# EAGLE design MeadowF7TestBoard_RevA (EAGLE 9.3.2)
PART_NUMBER: Meadow F7 Micro; REV: A
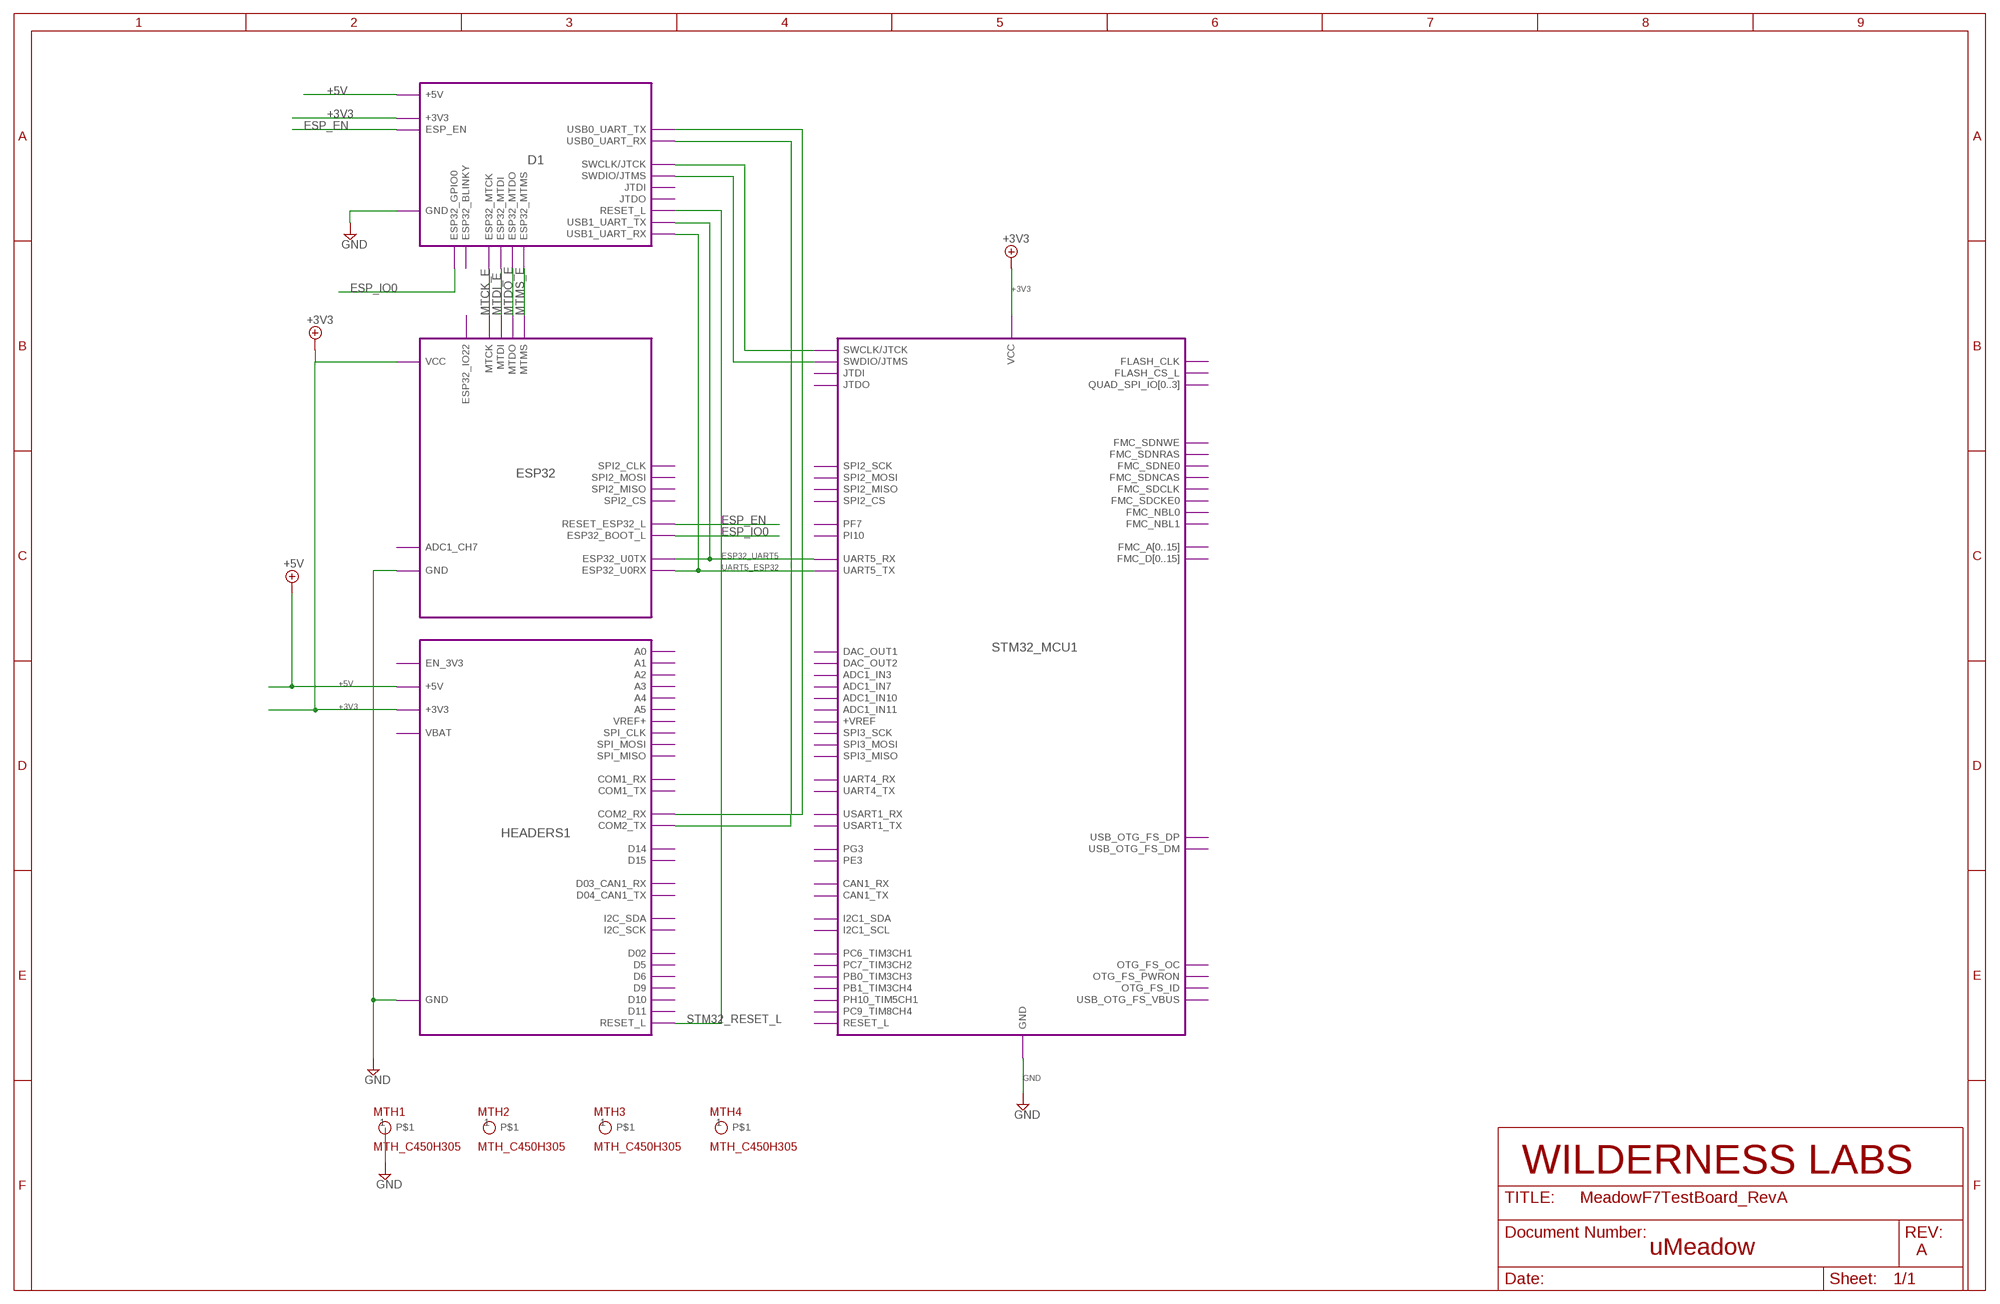
[diagram p0: schematic, sheet 1]

## Parts
MTH1  MTH_C450H305  [C450H305]
MTH2  MTH_C450H305  [C450H305]
MTH3  MTH_C450H305  [C450H305]
MTH4  MTH_C450H305  [C450H305]

## Module instances
STM32_MCU1 = STM32_MCU (part numbers offset by 400)
ESP32 = WIFI_BLUETOOTH (part numbers offset by 200)
HEADERS1 = HEADERS (part numbers offset by 300)
D1 = DEBUG (part numbers offset by 100)

## Nets
+3V3 [POWER]: port STM32_MCU1.VCC HEADERS1.+3V3 ESP32.VCC D1.+3V3
+5V [5V]: port HEADERS1.+5V D1.+5V ; supply symbol labelled +3V3
ESP32_UART5: port STM32_MCU1.UART5_RX ESP32.ESP32_U0TX D1.USB1_UART_TX
ESP_EN: port D1.ESP_EN ESP32.RESET_ESP32_L
ESP_IO0: port D1.ESP32_GPIO0 ESP32.ESP32_BOOT_L
GND [POWER]: MTH1.1 ; port ESP32.GND HEADERS1.GND STM32_MCU1.GND D1.GND
MTCK_E: port D1.ESP32_MTCK ESP32.MTCK
MTDI_E: port D1.ESP32_MTDI ESP32.MTDI
MTDO_E: port D1.ESP32_MTDO ESP32.MTDO
MTMS_E: port D1.ESP32_MTMS ESP32.MTMS
N$1: port D1.SWDIO/JTMS STM32_MCU1.SWDIO/JTMS
N$2: port D1.SWCLK/JTCK STM32_MCU1.SWCLK/JTCK
N$3: port D1.USB0_UART_RX HEADERS1.COM2_TX
N$4: port D1.USB0_UART_TX HEADERS1.COM2_RX
STM32_RESET_L: port HEADERS1.RESET_L D1.RESET_L
UART5_ESP32: port ESP32.ESP32_U0RX STM32_MCU1.UART5_TX D1.USB1_UART_RX
Unconnected: MTH2.1 MTH3.1 MTH4.1

## Library data of the parts
MTH1-MTH4 = SLJ_MECH:MTH_: Mounting Hole. C<X>H<Y> X is Pad diameter Y is drill diameter; DRILL: 3.05MM; PAD: 4.5MM

## Module STM32_MCU
Ports: SPI2_SCK(out) SPI2_MOSI(out) SPI2_MISO(in) SPI2_CS(out) PF7(out) PI10(out) UART5_RX(in) UART5_TX(out) FMC_A[0..15](out) FMC_D[0..15](io) FMC_NBL1(out) FMC_NBL0(out) FMC_SDCKE0(out) FMC_SDCLK(out) FMC_SDNCAS(out) FMC_SDNE0(out) FMC_SDNRAS(out) FMC_SDNWE(out) FLASH_CLK(out) FLASH_CS_L(out) QUAD_SPI_IO[0..3](io) DAC_OUT1(io) DAC_OUT2(io) ADC1_IN7(io) ADC1_IN10(io) ADC1_IN11(io) ADC1_IN3(io) +VREF(pas) SPI3_SCK(io) SPI3_MOSI(io) SPI3_MISO(io) UART4_RX(in) UART4_TX(out) USART1_TX(out) USART1_RX(in) PG3(io) PE3(io) CAN1_RX(io) CAN1_TX(io) I2C1_SDA(io) I2C1_SCL(io) PC6_TIM3CH1(io) PC7_TIM3CH2(io) PB0_TIM3CH3(io) PB1_TIM3CH4(io) PH10_TIM5CH1(io) PC9_TIM8CH4(io) RESET_L(io) OTG_FS_OC(in) OTG_FS_ID(in) USB_OTG_FS_VBUS(in) OTG_FS_PWRON(out) USB_OTG_FS_DP(io) USB_OTG_FS_DM(io) VCC(pwr) GND(pwr) SWCLK/JTCK(io) SWDIO/JTMS(io) JTDI(io) JTDO(io)
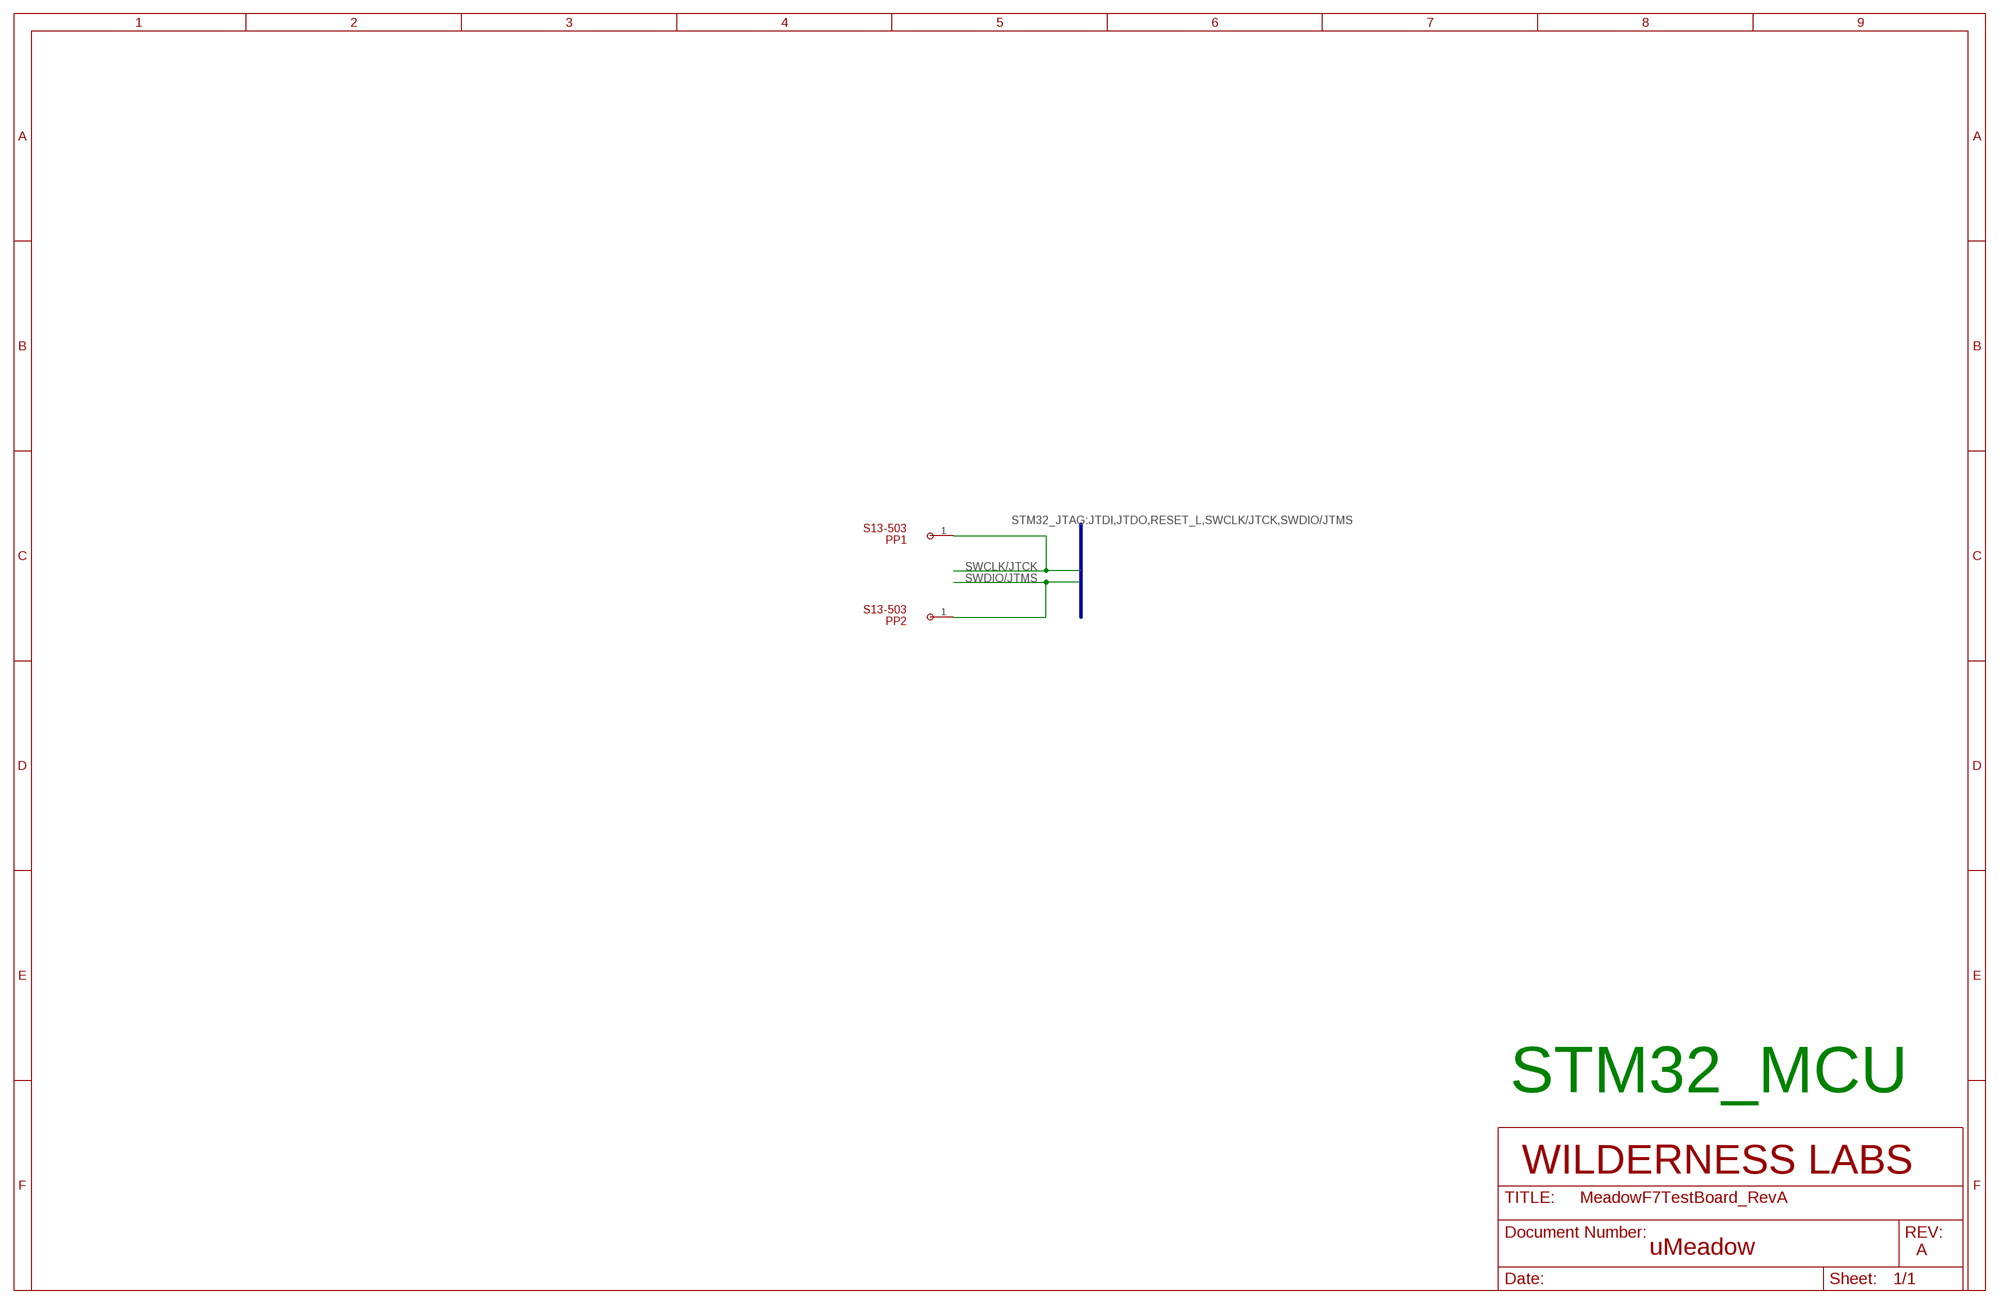
[diagram p1: schematic, module STM32_MCU, sheet 1]

### Parts
PP1  POGOS13-503  [C140H90]
PP2  POGOS13-503  [C140H90]

### Nets
SWCLK/JTCK: PP1.1
SWDIO/JTMS: PP2.1

### Buses
STM32_JTAG:JTDI,JTDO,RESET_L,SWCLK/JTCK,SWDIO/JTMS

### Library data of the parts
PP1 PP2 = SLJ_MECH:POGO: Pogo Pin, Lead, Probe Sleeve for use with P19-xx21 Series; MANUFACTURER: HARWIN INC; PART_NUMBER: S13-503

## Module WIFI_BLUETOOTH
Ports: SPI2_CLK(in) SPI2_MOSI(in) SPI2_MISO(out) SPI2_CS(in) ESP32_U0RX(in) ESP32_U0TX(out) RESET_ESP32_L(in) ESP32_BOOT_L(in) GND(pwr) VCC(pwr) MTCK(io) MTDI(io) MTDO(io) MTMS(io) ADC1_CH7(in) ESP32_IO22(out)
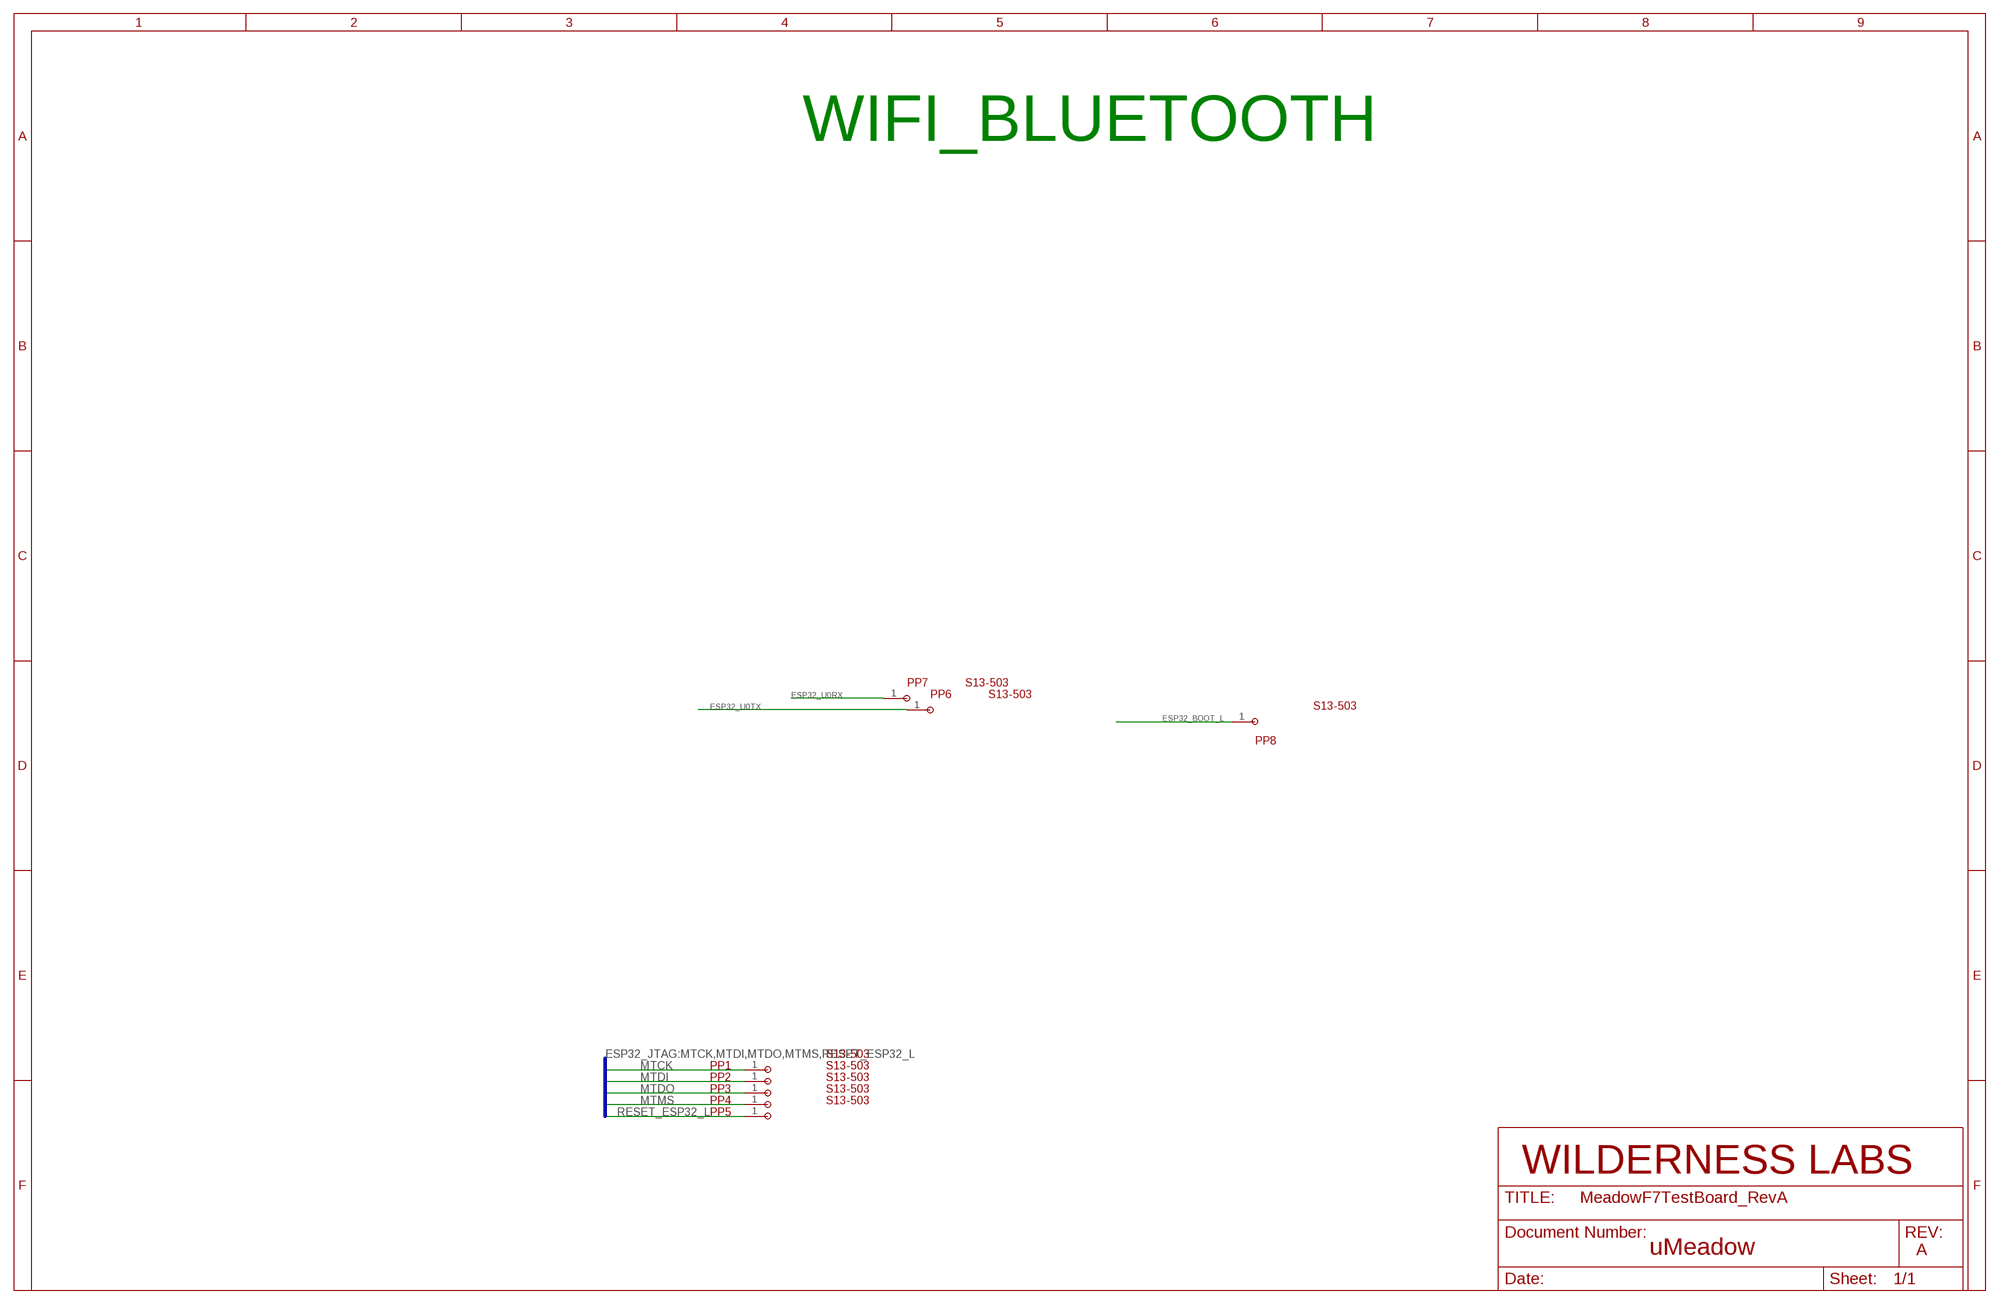
[diagram p2: schematic, module WIFI_BLUETOOTH, sheet 1]

### Parts
PP1  POGOS13-503  [C140H90]
PP2  POGOS13-503  [C140H90]
PP3  POGOS13-503  [C140H90]
PP4  POGOS13-503  [C140H90]
PP5  POGOS13-503  [C140H90]
PP6  POGOS13-503  [C140H90]
PP7  POGOS13-503  [C140H90]
PP8  POGOS13-503  [C140H90]

### Nets
ESP32_BOOT_L: PP8.1
ESP32_U0RX: PP7.1
ESP32_U0TX: PP6.1
MTCK: PP1.1
MTDI: PP2.1
MTDO: PP3.1
MTMS: PP4.1
RESET_ESP32_L: PP5.1

### Buses
ESP32_JTAG:MTCK,MTDI,MTDO,MTMS,RESET_ESP32_L

### Library data of the parts
PP1-PP8 = SLJ_MECH:POGO: Pogo Pin, Lead, Probe Sleeve for use with P19-xx21 Series; MANUFACTURER: HARWIN INC; PART_NUMBER: S13-503

## Module HEADERS
Ports: A0(io) A1(io) A2(out) A3(out) A4(out) A5(out) SPI_CLK(io) SPI_MOSI(io) SPI_MISO(io) COM1_RX(out) COM1_TX(in) COM2_TX(in) COM2_RX(out) D14(io) D15(io) D03_CAN1_RX(io) D04_CAN1_TX(io) I2C_SDA(io) I2C_SCK(io) D02(io) D5(io) D6(io) D9(io) D10(io) D11(io) RESET_L(io) EN_3V3(out) +5V(pwr) +3V3(pwr) GND(pwr) VBAT(pwr) VREF+(pwr)
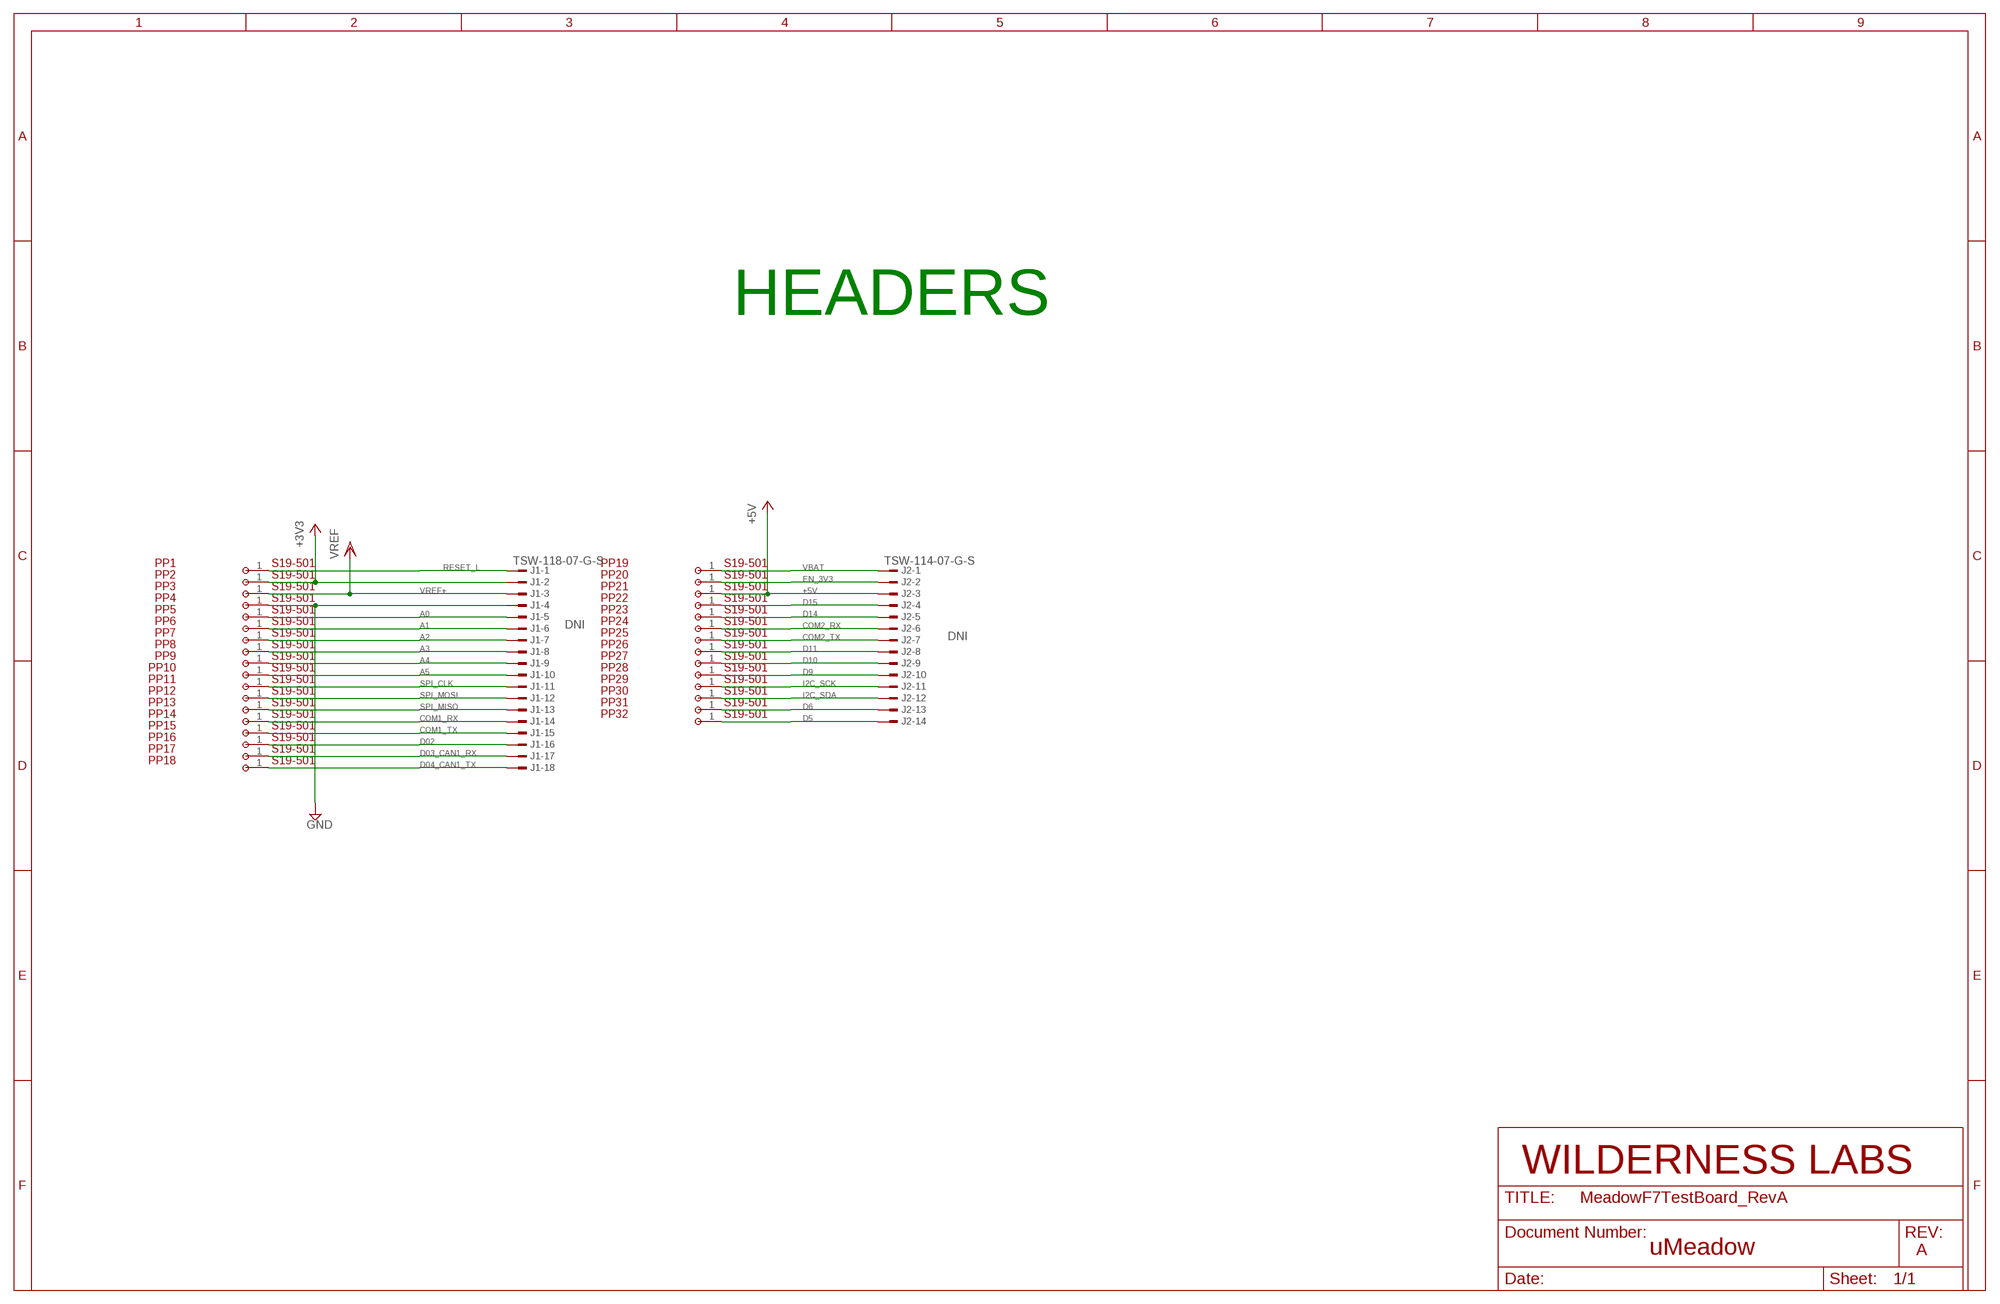
[diagram p3: schematic, module HEADERS, sheet 1]

### Parts
J1  TSW-118-07-G-S  [TSW-118-XX-G-S]
J2  TSW-114-07-G-S  [TSW-114-XX-G-S]
PP1  POGOS19-501  [C195H135]
PP2  POGOS19-501  [C195H135]
PP3  POGOS19-501  [C195H135]
PP4  POGOS19-501  [C195H135]
PP5  POGOS19-501  [C195H135]
PP6  POGOS19-501  [C195H135]
PP7  POGOS19-501  [C195H135]
PP8  POGOS19-501  [C195H135]
PP9  POGOS19-501  [C195H135]
PP10  POGOS19-501  [C195H135]
PP11  POGOS19-501  [C195H135]
PP12  POGOS19-501  [C195H135]
PP13  POGOS19-501  [C195H135]
PP14  POGOS19-501  [C195H135]
PP15  POGOS19-501  [C195H135]
PP16  POGOS19-501  [C195H135]
PP17  POGOS19-501  [C195H135]
PP18  POGOS19-501  [C195H135]
PP19  POGOS19-501  [C195H135]
PP20  POGOS19-501  [C195H135]
PP21  POGOS19-501  [C195H135]
PP22  POGOS19-501  [C195H135]
PP23  POGOS19-501  [C195H135]
PP24  POGOS19-501  [C195H135]
PP25  POGOS19-501  [C195H135]
PP26  POGOS19-501  [C195H135]
PP27  POGOS19-501  [C195H135]
PP28  POGOS19-501  [C195H135]
PP29  POGOS19-501  [C195H135]
PP30  POGOS19-501  [C195H135]
PP31  POGOS19-501  [C195H135]
PP32  POGOS19-501  [C195H135]

### Nets
+3V3: J1.2 PP2.1
+5V: J2.3 PP21.1
A0: J1.5 PP5.1
A1: J1.6 PP6.1
A2: J1.7 PP7.1
A3: J1.8 PP8.1
A4: J1.9 PP9.1
A5: J1.10 PP10.1
COM1_RX: J1.14 PP14.1
COM1_TX: J1.15 PP15.1
COM2_RX: J2.6 PP24.1
COM2_TX: J2.7 PP25.1
D02: J1.16 PP16.1
D03_CAN1_RX: J1.17 PP17.1
D04_CAN1_TX: J1.18 PP18.1
D5: J2.14 PP32.1
D6: J2.13 PP31.1
D9: J2.10 PP28.1
D10: J2.9 PP27.1
D11: J2.8 PP26.1
D14: J2.5 PP23.1
D15: J2.4 PP22.1
EN_3V3: J2.2 PP20.1
GND: J1.4 PP4.1
I2C_SCK: J2.11 PP29.1
I2C_SDA: J2.12 PP30.1
RESET_L: J1.1 PP1.1
SPI_CLK: J1.11 PP11.1
SPI_MISO: J1.13 PP13.1
SPI_MOSI: J1.12 PP12.1
VBAT: J2.1 PP19.1
VREF+: J1.3 PP3.1 ; supply symbol labelled VREF

### Library data of the parts
J1 = con-samtec:TSW-118-*-G-S: THROUGH-HOLE .025" SQ POST HEADER Source: Samtec TSW.pdf; DNI: DNI; MANUFACTURER: Samtec; MF: Samtec Inc.; MPN: TSW-118-07-G-S; PART_NUMBER: TSW-118-07-G-S
J2 = con-samtec:TSW-114-*-G-S: THROUGH-HOLE .025" SQ POST HEADER Source: Samtec TSW.pdf; DNI: DNI; MF: Samtec Inc.; MPN: TSW-114-07-G-S
PP1-PP32 = SLJ_MECH:POGO: Pogo Pin, Lead, Probe Sleeve for use with P19-xx21 Series; MANUFACTURER: HARWIN; PART_NUMBER: S19-501

## Module DEBUG
Ports: USB0_UART_TX(out) USB0_UART_RX(in) +3V3(pwr) GND(pwr) ESP32_MTCK(io) ESP32_MTDI(io) ESP32_MTDO(io) ESP32_MTMS(io) ESP_EN(out) SWCLK/JTCK(io) SWDIO/JTMS(io) JTDI(io) JTDO(io) RESET_L(io) +5V(pwr) USB1_UART_TX(out) USB1_UART_RX(in) ESP32_GPIO0(out) ESP32_BLINKY(in)
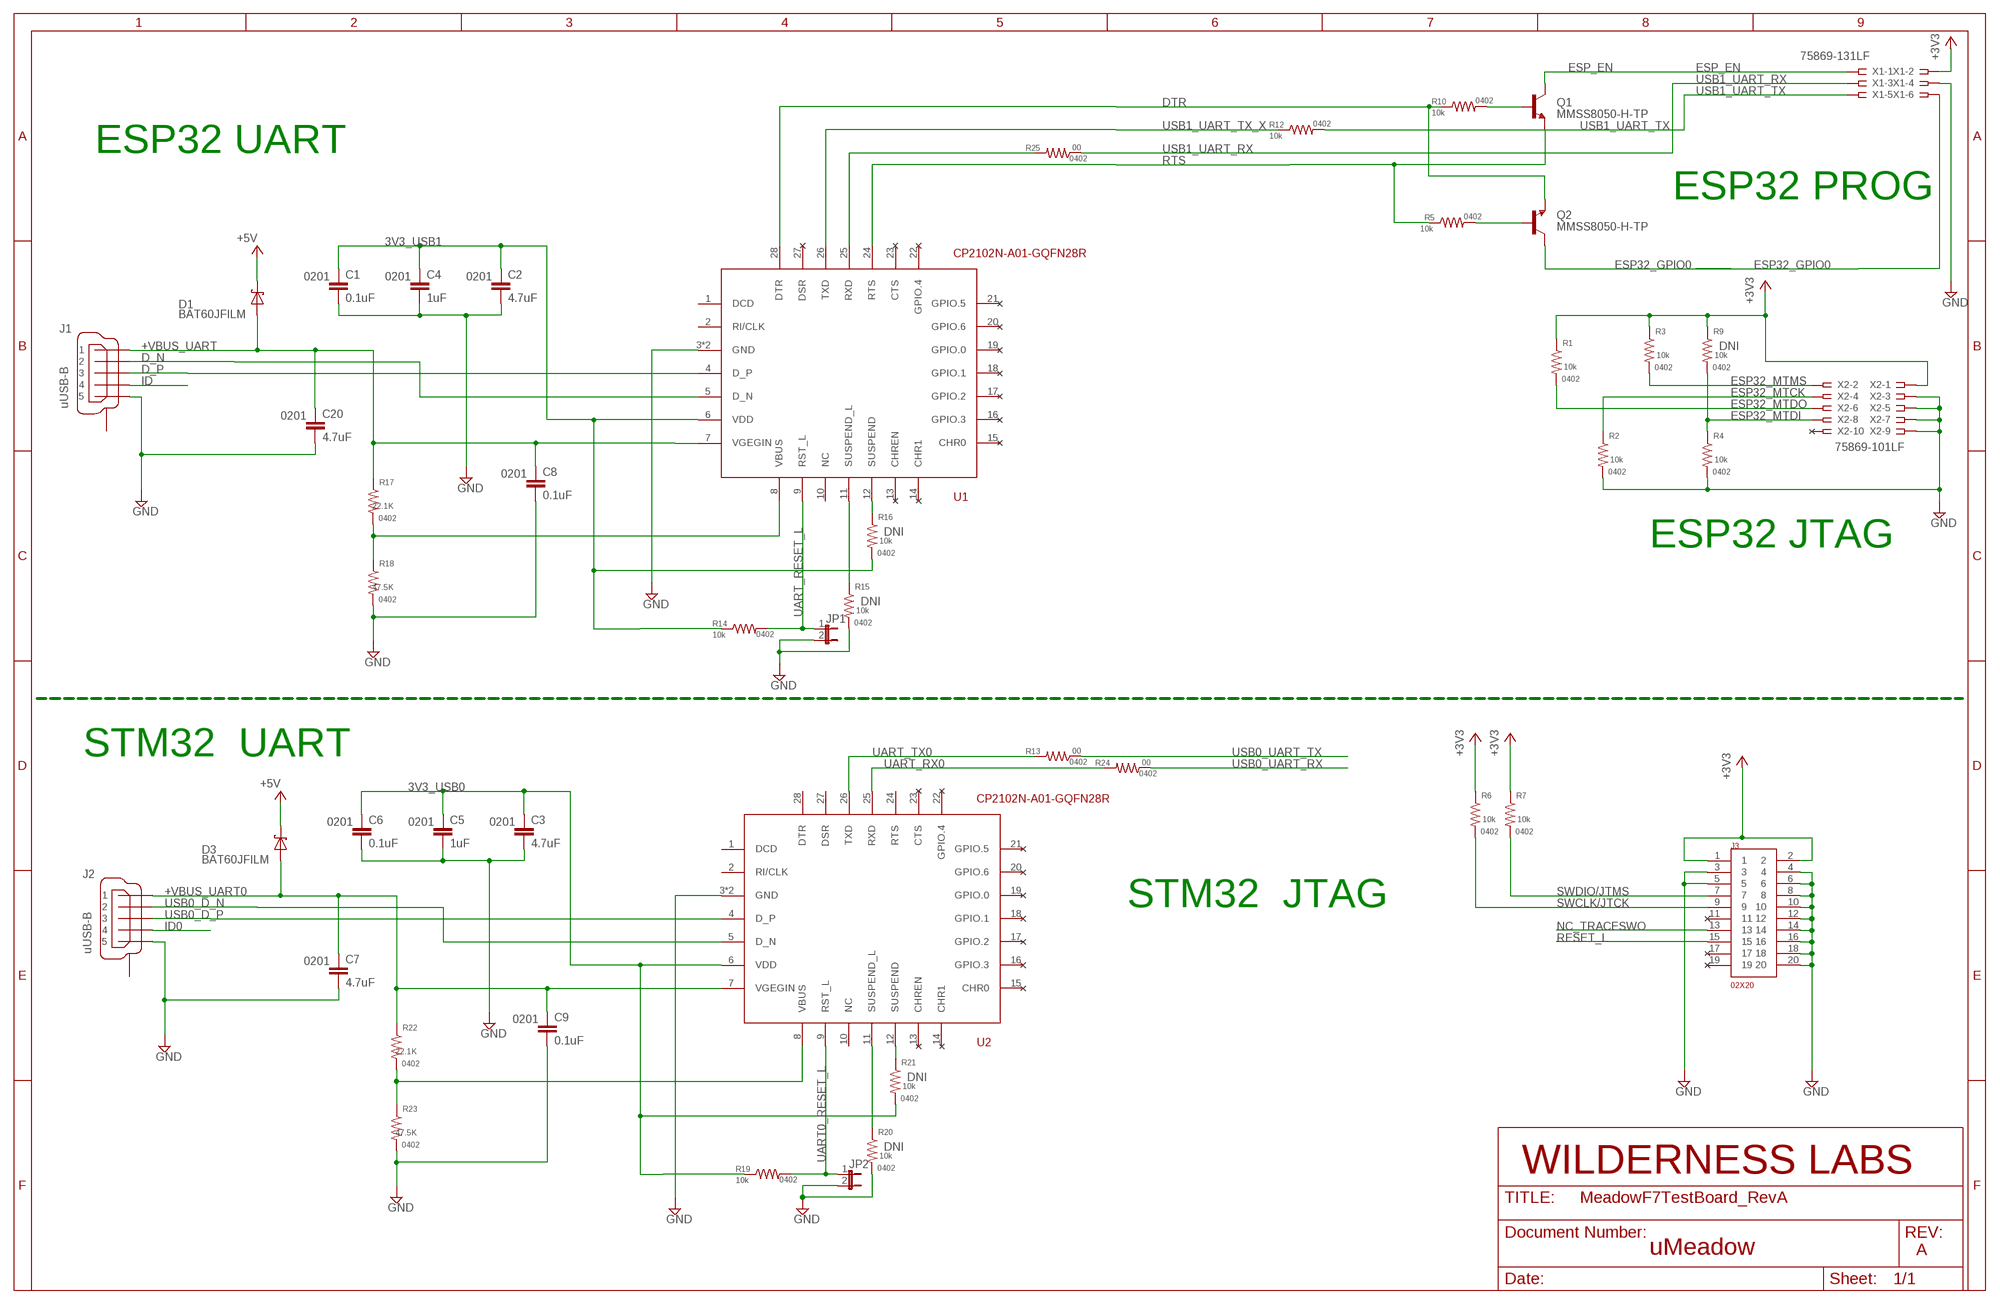
[diagram p4: schematic, module DEBUG, sheet 1]

### Parts
C1  0.1uF  CC0201  [C0201]
C2  4.7uF  CC0201  [C0201]
C3  4.7uF  CC0201  [C0201]
C4  1uF  CC0201  [C0201]
C5  1uF  CC0201  [C0201]
C6  0.1uF  CC0201  [C0201]
C7  4.7uF  CC0201  [C0201]
C8  0.1uF  CC0201  [C0201]
C9  0.1uF  CC0201  [C0201]
C20  4.7uF  CC0201  [C0201]
D1  BAT60JFILM  [SOD2512X117]
D3  BAT60JFILM  [SOD2512X117]
J1  uUSB-B  MICROUSB_0473461001  [USB_473461001]
J2  uUSB-B  MICROUSB_0473461001  [USB_473461001]
J3  02X20  CON_02X10_VERT_100  [HDRV20W64P254_2X10_3276X876X838B]
JP1  JP1E  [JP1]
JP2  JP1E  [JP1]
Q1  MMSS8050-H-TP  [SOT-23]
Q2  MMSS8050-H-TP  [SOT-23]
R1  10k  R-US_R0402  [R0402]
R2  10k  R-US_R0402  [R0402]
R3  10k  R-US_R0402  [R0402]
R4  10k  R-US_R0402  [R0402]
R5  10k  R-US_R0402  [R0402]
R6  10k  R-US_R0402  [R0402]
R7  10k  R-US_R0402  [R0402]
R9  10k  R-US_R0402  [R0402]
R10  10k  R-US_R0402  [R0402]
R12  10k  R-US_R0402  [R0402]
R13  00  R-US_R0402  [R0402]
R14  10k  R-US_R0402  [R0402]
R15  10k  R-US_R0402  [R0402]
R16  10k  R-US_R0402  [R0402]
R17  22.1K  R-US_R0402  [R0402]
R18  47.5K  R-US_R0402  [R0402]
R19  10k  R-US_R0402  [R0402]
R20  10k  R-US_R0402  [R0402]
R21  10k  R-US_R0402  [R0402]
R22  22.1K  R-US_R0402  [R0402]
R23  47.5K  R-US_R0402  [R0402]
R24  00  R-US_R0402  [R0402]
R25  00  R-US_R0402  [R0402]
U1  CP2102N-A01-GQFN28R  [QFN50P500X500X80-29T335]
U2  CP2102N-A01-GQFN28R  [QFN50P500X500X80-29T335]
X1  75869-131LF  SSW-103-02-G-D  [SSW-103-02-G-D]
X2  75869-101LF  SSW-105-02-G-D  [SSW-105-02-G-D]

### Nets
3V3_USB0: C3.1 C5.1 C6.1 R19.1 R21.2 U2.6(VDD)
3V3_USB1: C1.1 C2.1 C4.1 R14.1 R16.2 U1.6(VDD)
+3V3: J3.1 J3.2 R1.1 R3.1 R6.1 R7.1 R9.1 X1.2 X2.1
+5V: D1.1(C) D3.1(C)
+VBUS_UART: C8.1 C20.1 D1.2(A) J1.1 R17.1 U1.7(VGEGIN)
+VBUS_UART0: C7.1 C9.1 D3.2(A) J2.1 R22.1 U2.7(VGEGIN)
D_N [USB]: J1.2 U1.5(D_N)
D_P [USB]: J1.3 U1.4(D_P)
DTR: Q2.2(E) R10.1 U1.28(DTR)
ESP32_GPIO0: Q2.1(C) X1.6
ESP32_MTCK: R2.1 X2.4
ESP32_MTDI: R4.1 R9.2 X2.8
ESP32_MTDO: R1.2 X2.6
ESP32_MTMS: R3.2 X2.2
ESP_EN: Q1.1(C) X1.1
GND: C1.2 C2.2 C3.2 C4.2 C5.2 C6.2 C7.2 C8.2 C9.2 C20.2 J1.5 J2.5 J3.3 J3.4 J3.5 J3.6 J3.8 J3.10 J3.12 J3.14 J3.16 J3.18 J3.20 JP1.2 JP2.2 R2.2 R4.2 R15.2 R18.2 R20.2 R23.2 U1.3(GND) U1.29(GND) U2.3(GND) U2.29(GND) X1.4 X2.3 X2.5 X2.7 X2.9
ID: J1.4
ID0: J2.4
N$1: Q1.3(B) R10.2
N$2: Q2.3(B) R5.2
N$3: R16.1 U1.12(SUSPEND)
N$4: R17.2 R18.1 U1.8(VBUS)
N$5: R25.2 U1.25(RXD)
N$6: R15.1 U1.11(SUSPEND_L)
N$8: R20.1 U2.11(SUSPEND_L)
N$9: R21.1 U2.12(SUSPEND)
N$10: R22.2 R23.1 U2.8(VBUS)
NC_TRACESWO: J3.13
RESET_L [MEM_DATA]: J3.15
RTS: Q1.2(E) R5.1 U1.24(RTS)
SWCLK/JTCK: J3.9 R6.2
SWDIO/JTMS: J3.7 R7.2
UART0_RESET_L: JP2.1 R19.2 U2.9(RST_L)
UART_RESET_L: JP1.1 R14.2 U1.9(RST_L)
UART_RX0: R24.2 U2.25(RXD)
UART_TX0: R13.2 U2.26(TXD)
USB0_D_N [USB]: J2.2 U2.5(D_N)
USB0_D_P [USB]: J2.3 U2.4(D_P)
USB0_UART_RX: R24.1
USB0_UART_TX: R13.1
USB1_UART_RX: R25.1 X1.3
USB1_UART_TX: R12.2 X1.5
USB1_UART_TX_X: R12.1 U1.26(TXD)
Unconnected: J1.SHD1(SHIELD) J1.SHD2(SHIELD) J1.SHD3(SHIELD) J1.SHD4(SHIELD) J1.SHD5(SHIELD) J1.SHD6(SHIELD) J2.SHD1(SHIELD) J2.SHD2(SHIELD) J2.SHD3(SHIELD) J2.SHD4(SHIELD) J2.SHD5(SHIELD) J2.SHD6(SHIELD) J3.11 J3.17 J3.19 U1.1(DCD) U1.2(RI/CLK) U1.10(NC) U1.13(CHREN) U1.14(CHR1) U1.15(CHR0) U1.16(GPIO.3) U1.17(GPIO.2) U1.18(GPIO.1) U1.19(GPIO.0) U1.20(GPIO.6) U1.21(GPIO.5) U1.22(GPIO.4) U1.23(CTS) U1.27(DSR) U2.1(DCD) U2.2(RI/CLK) U2.10(NC) U2.13(CHREN) U2.14(CHR1) U2.15(CHR0) U2.16(GPIO.3) U2.17(GPIO.2) U2.18(GPIO.1) U2.19(GPIO.0) U2.20(GPIO.6) U2.21(GPIO.5) U2.22(GPIO.4) U2.23(CTS) U2.24(RTS) U2.27(DSR) U2.28(DTR) X2.10

### Notes on the sheet
- ESP32 UART
- ESP32 PROG
- ESP32 JTAG
- STM32  UART
- STM32  JTAG

### Library data of the parts
C1 C6 C8 C9 = eagle-ltspice:C: CAPACITOR, European symbol; FOOTPRINT: 0201; MANUFACTURER: Murata Electronica; PART_NUMBER: GRM033R61A104ME15D; SPICEMODEL: NONE; SPICEPREFIX: C; VOLTAGE: 10V
C2 C3 C7 C20 = eagle-ltspice:C: CAPACITOR, European symbol; FOOTPRINT: 0201; MANUFACTURER: Murata Electronica; PART_NUMBER: GRM035R60J475ME15D; SPICEMODEL: NONE; SPICEPREFIX: C; VOLTAGE: 6.3V
C4 C5 = eagle-ltspice:C: CAPACITOR, European symbol; FOOTPRINT: 0201; MANUFACTURER: Murata Electronica; PART_NUMBER: GRT033R60J105ME13D; SPICEMODEL: NONE; SPICEPREFIX: C; VOLTAGE: 6.3V
D1 D3 = SLJ_Diodes:BAT60JFILM: Schottky Diode STM BAT60 http://www.st.com/content/ccc/resource/technical/document/datasheet/3d/d2/27/1d/20/e3/4d/48/CD00001944.pdf/files/CD00001944.pdf/jcr:content/translations/en.CD00001944.pdf; MANUFACTURER: STMicroelectronics; PART_NUMBER: BAT60JFILM
J1 J2 = SLJ_Connectors:MICROUSB_0473461001: USB - micro B USB 2.0 Receptacle Connector 5 Position Surface Mount, Right Angle; MANUFACTURER: Molex; PART_NUMBER: 0473461001
J3 = SLJ_Connectors:CON_02X10_VERT_100: Connector Header Through Hole 20 position 0.100" (2.54mm); MANUFACTURER: AMPHENOL FCI; PART_NUMBER: 52601-S20-4LF
JP1 JP2 = jumper:JP1E: JUMPER
Q1 Q2 = SLJ_TRANSISTORS:MMSS8050-H-TP: Bipolar (BJT) Transistor NPN 25V 1.5A 100MHz 625mW Surface Mount SOT-23; FOOTPRINT: SOT-23; MANUFACTURER: Micro Commercial; PART_NUMBER: MMSS8050-H-TP
R1-R7 R10 R12 R14 R19 = rcl:R-US_: RESISTOR, American symbol; FOOTPRINT: 0402; MANUFACTURER: Stackpole; PART_NUMBER: RMCF0402FT10K0; SPICEPREFIX: R
R9 R15 R16 R20 R21 = rcl:R-US_: RESISTOR, American symbol; DNI: DNI; FOOTPRINT: 0402; MANUFACTURER: Stackpole; PART_NUMBER: RMCF0402FT10K0; SPICEPREFIX: R
R13 R24 R25 = rcl:R-US_: RESISTOR, American symbol; FOOTPRINT: 0402; MANUFACTURER: Panasonic; PART_NUMBER: ERJ-2GE0R00X; SPICEPREFIX: R
R17 R22 = rcl:R-US_: RESISTOR, American symbol; FOOTPRINT: 0402; MANUFACTURER: Vishay Dale; PART_NUMBER: TNPW040222K1BEED; SPICEPREFIX: R
R18 R23 = rcl:R-US_: RESISTOR, American symbol; FOOTPRINT: 0402; MANUFACTURER: Stackpole; PART_NUMBER: RMCF0402FT47K5; SPICEPREFIX: R
U1 U2 = SLJ_IC:CP2102N-A01-GQFN28R: USB Bridge, USB to UART USB 2.0 UART Interface 28-QFN (5x5); MANUFACTURER: Silicon Labs; PART_NUMBER: CP2102N-A01-GQFN28R
X1 = con-samtec:SSW-103-02-G: THROUGH-HOLE .025" SQ POST SOCKET Source: Samtec SSW.pdf; MANUFACTURER: Amphenol ICC (FCI); OC_FARNELL: unknown; OC_NEWARK: 11P9365; PART_NUMBER: 75869-131LF
X2 = con-samtec:SSW-105-02-G: THROUGH-HOLE .025" SQ POST SOCKET Source: Samtec SSW.pdf; MANUFACTURER: Amphenol ICC (FCI); MF: Amphenol ICC (FCI); MPN: 75869-101LF; OC_FARNELL: unknown; OC_NEWARK: 11P9398; PART_NUMBER: 75869-101LF

## Net classes
1 USB: width 0.216 mm, drill 0.102 mm, clearance 0.229 mm
2 MEM_ADDR_CNT: width 0.102 mm, drill 0.102 mm
3 MEM_DATA: width 0.102 mm
4 5V: width 0.1 mm
5 50ohm: width 0.1 mm
6 POWER: width 0.1 mm, drill 0.203 mm
7 CLK: width 0.1 mm, drill 0.203 mm
8 ANT: clearance 0.3 mm

## Board
uMeadow eval Kit.
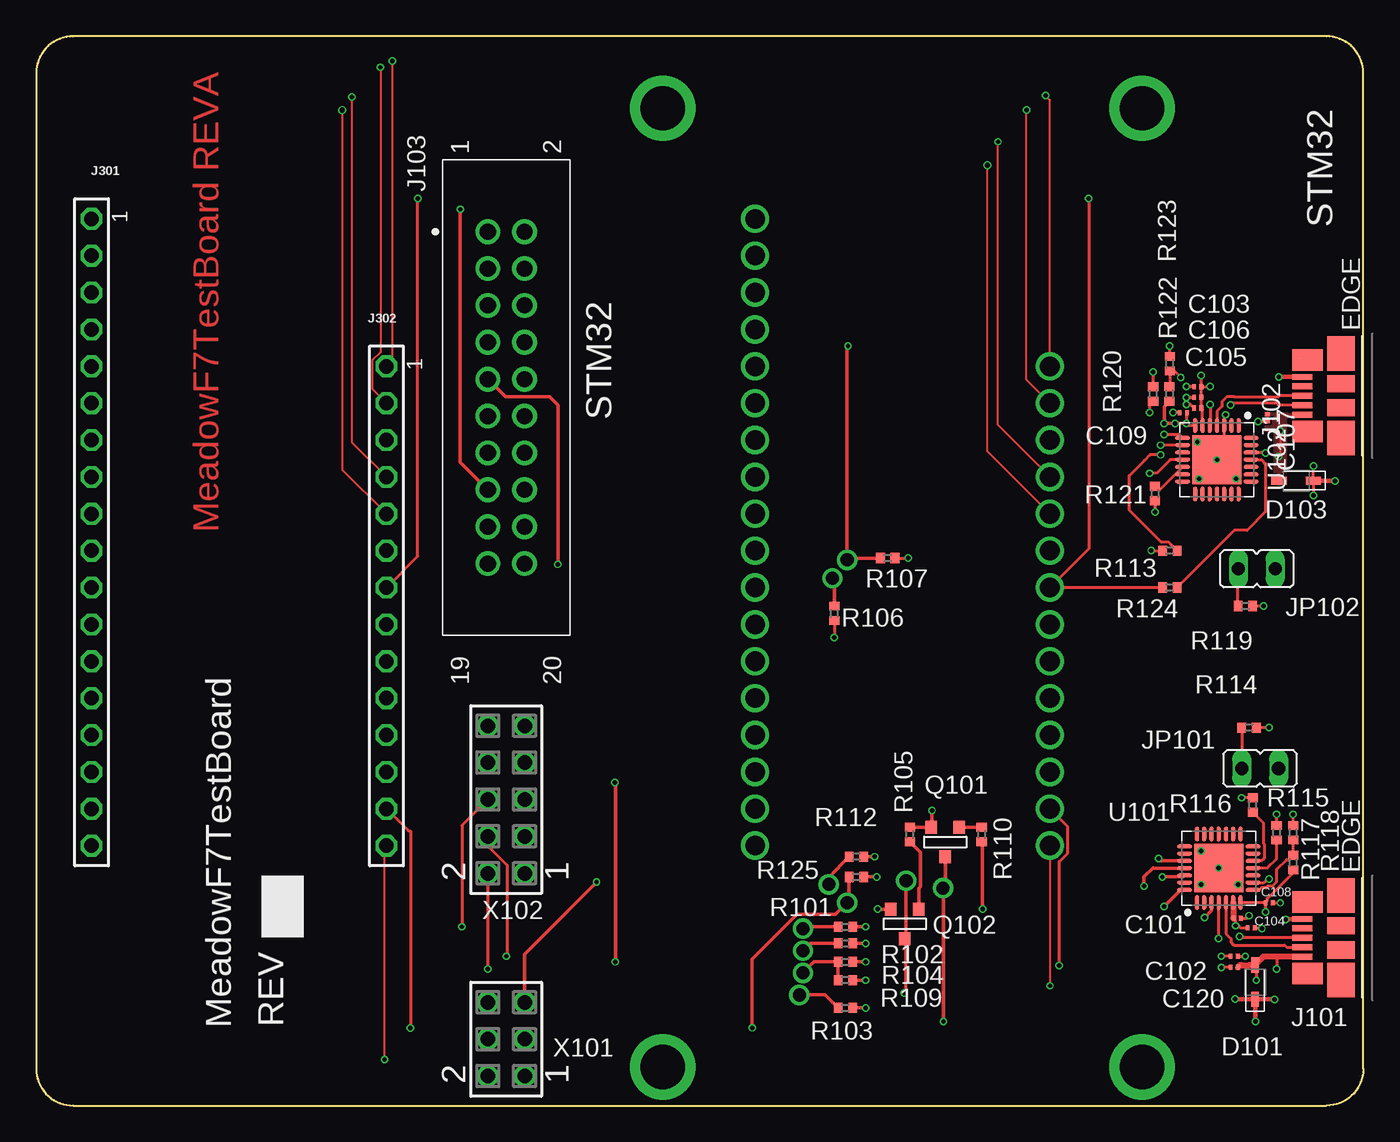
[diagram p5: board, top side]
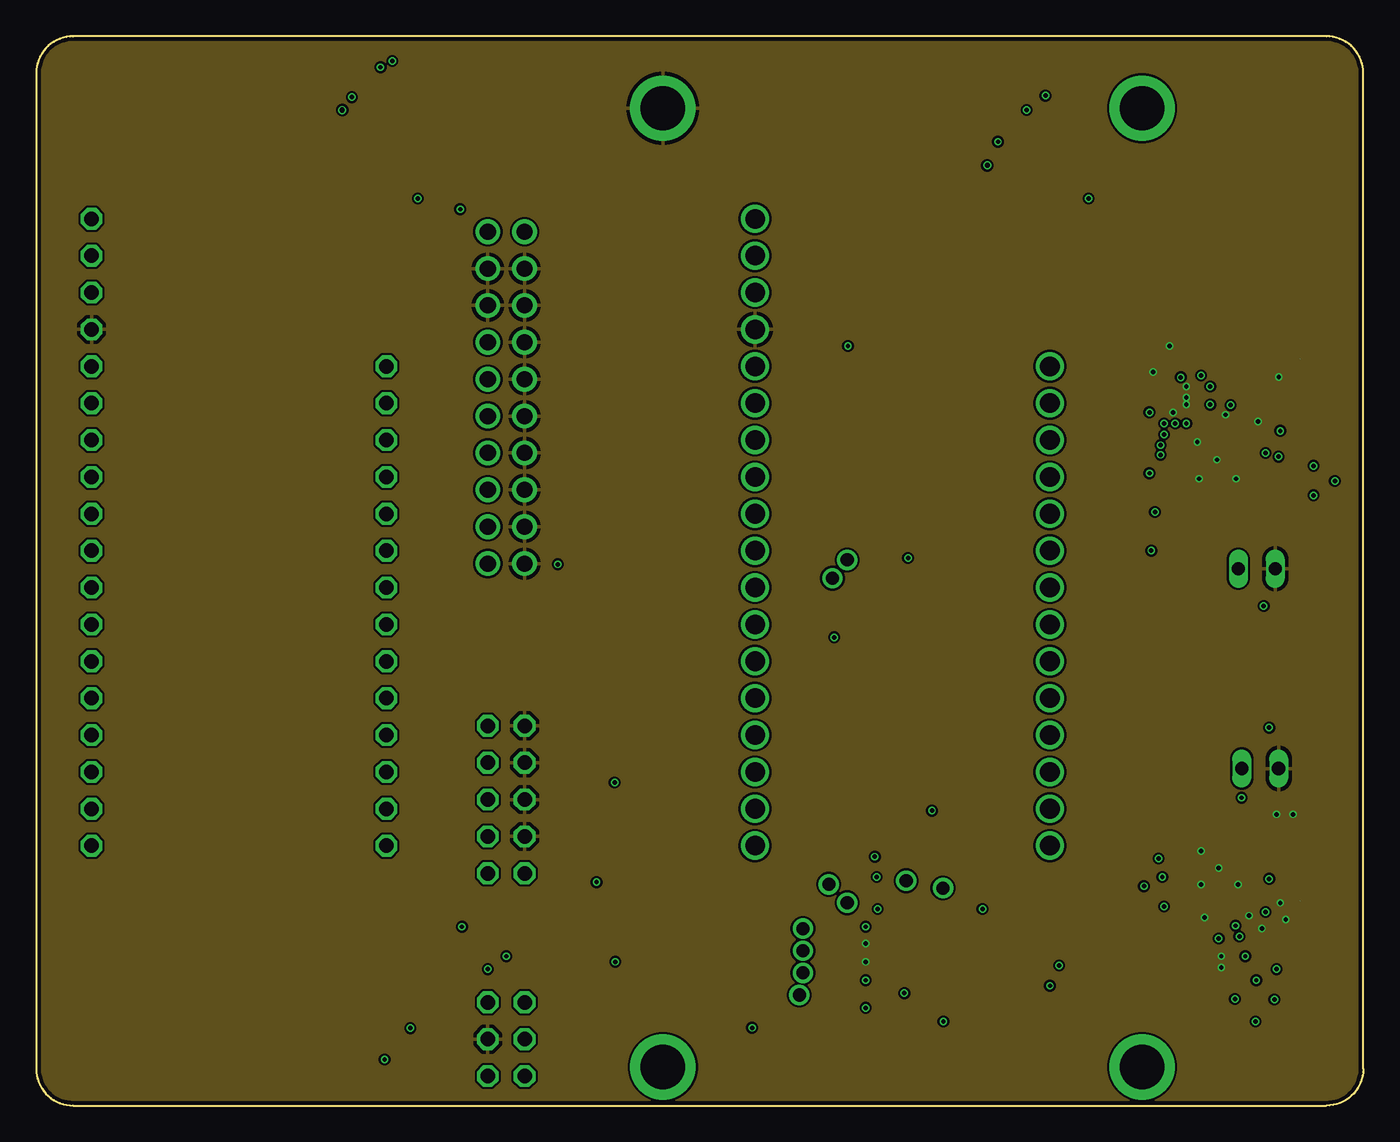
[diagram p6: board, inner layer Route2]
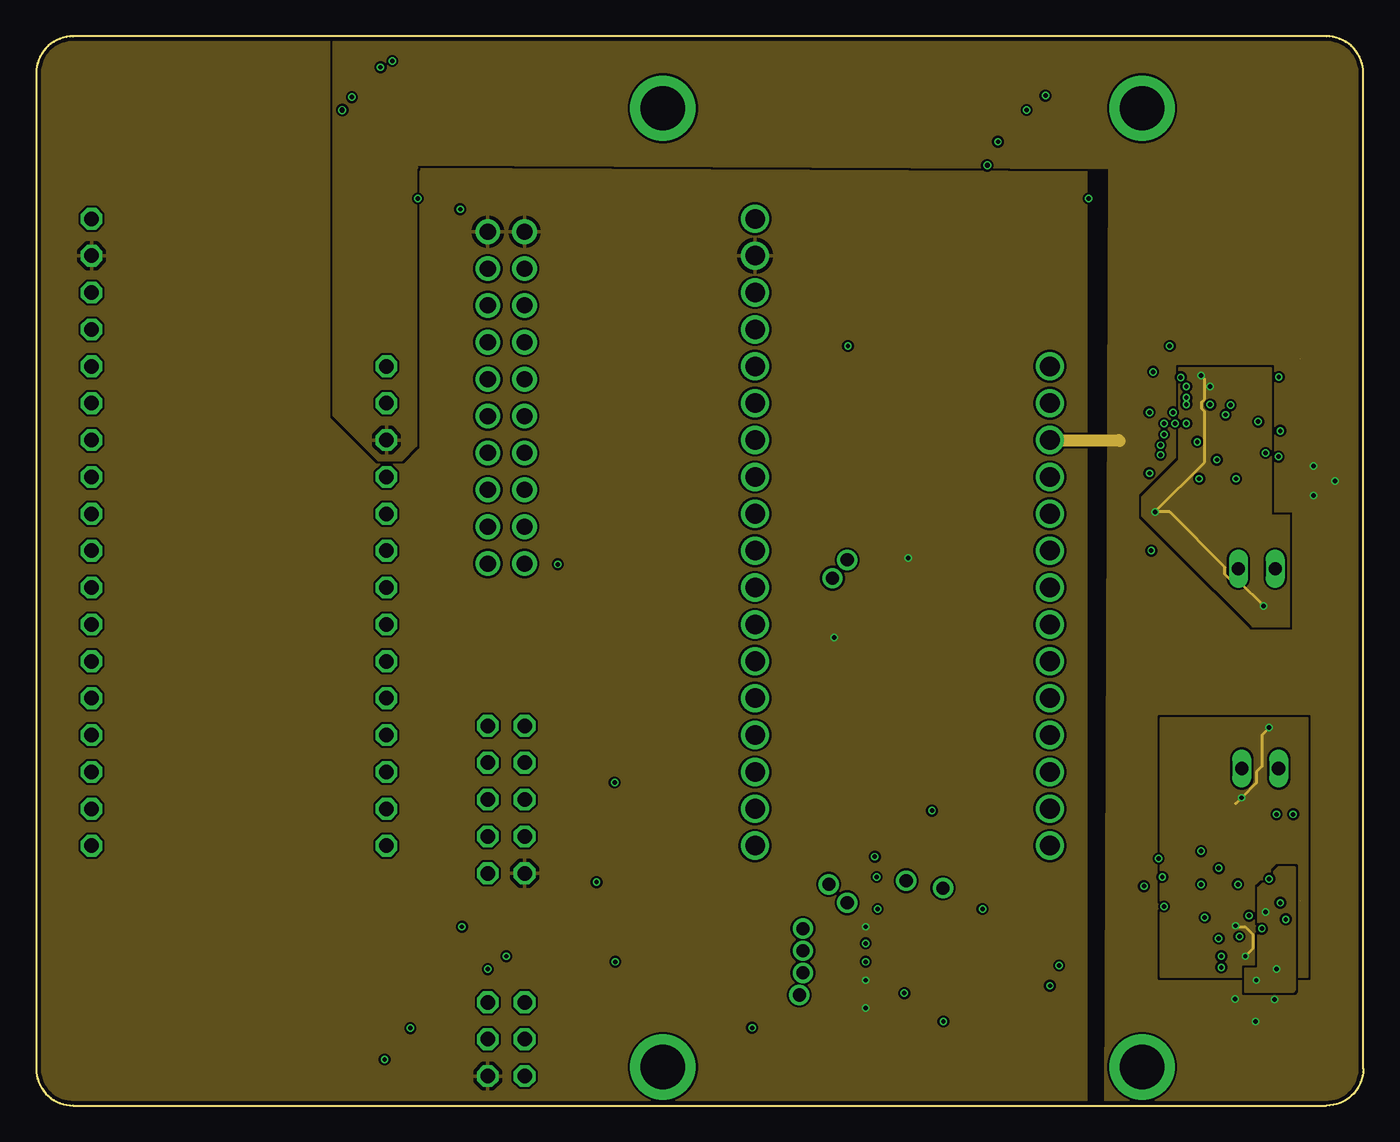
[diagram p7: board, inner layer Route15]
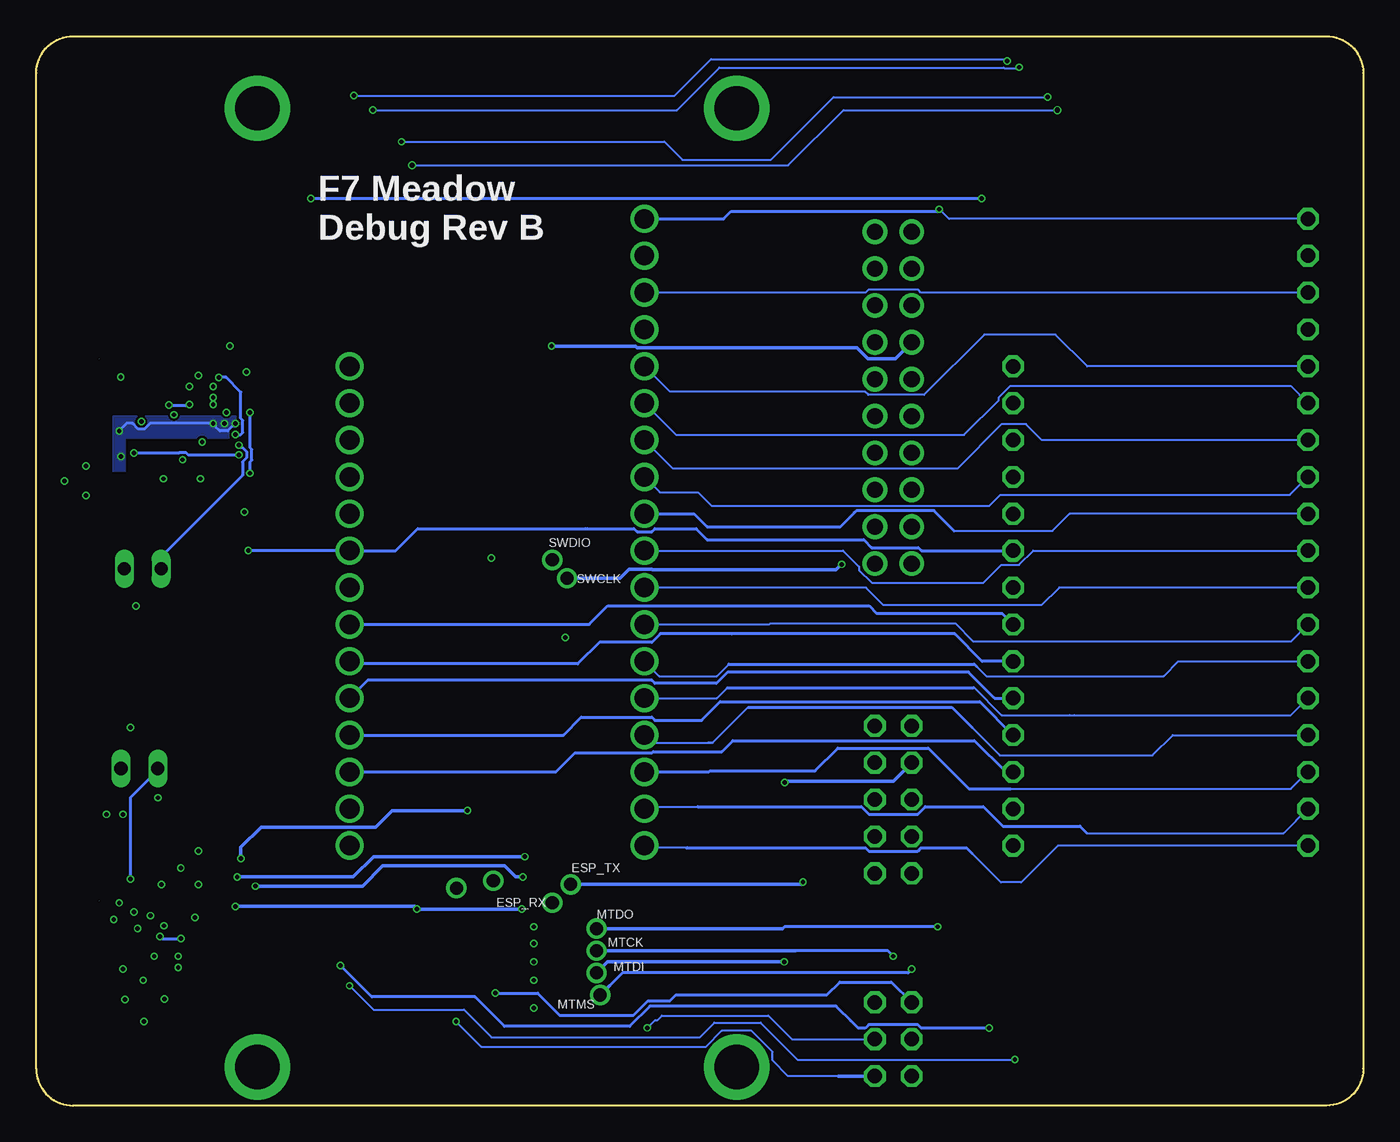
[diagram p8: board, bottom side, seen from below]

Size 91.44 x 73.66 mm. Coordinates in mm from the lower left corner, seen from the top.
Outline: 0,71.12 0,2.54 arc90 2.54,0 88.9,0 arc90 91.44,2.54 91.44,71.12 arc90 88.9,73.66 2.54,73.66 arc90 0,71.12
Copper layers (1+2*15+16): Top 0.035559375mm / dielectric 5mil / Route2 0.035559375mm / dielectric 47mil / Route15 0.035559375mm / dielectric 5mil / Bottom 0.035559375mm
Design rules "default *": minimum track width 5mil, minimum drill 0.2mm, track to track 6mil, track to pad 6mil, pad to pad 4mil, via to via 6mil, smd to smd 0mil, copper to edge 10mil, drill to drill 6mil, minimum pad ring 0.1mm, minimum via ring 4mil, stop-mask expansion 1mil, vias tented up to drill 20mil, thermal gap 10mil

### Footprints (pad centres in the part's own frame; a part is rotated, then mirrored left to right if it is on the bottom)
C0201 = smd 0.25 x 0.35: 1 -0.25,0; 2 0.25,0
SOD2512X117 = smd 1.054 x 0.53: 1 -1.181,0; 2 1.181,0
USB_473461001 = smd 0.4 x 1.35: 1 -1.3,2.675; 2 -0.65,2.675; 3 0,2.675; 4 0.65,2.675; 5 1.3,2.675 | smd 1.5 x 2.1: SHD1 2.462,2.3; SHD2 -2.462,2.3 | smd 1.175 x 1.9: SHD3 0.838,0; SHD4 -0.838,0 | smd 2.375 x 1.9: SHD5 -2.913,0; SHD6 2.913,0
HDRV20W64P254_2X10_3276X876X838B = drill 1.105 pad 1.705: 1 0,0; 2 0,2.54; 3 2.54,0; 4 2.54,2.54; 5 5.08,0; 6 5.08,2.54; 7 7.62,0; 8 7.62,2.54; 9 10.16,0; 10 10.16,2.54; 11 12.7,0; 12 12.7,2.54; 13 15.24,0; 14 15.24,2.54; 15 17.78,0; 16 17.78,2.54; 17 20.32,0; 18 20.32,2.54; 19 22.86,0; 20 22.86,2.54
TSW-118-XX-G-S = drill 1 pad 1.5 octagon: 1 21.59,0; 2 19.05,0; 3 16.51,0; 4 13.97,0; 5 11.43,0; 6 8.89,0; 7 6.35,0; 8 3.81,0; 9 1.27,0; 10 -1.27,0; 11 -3.81,0; 12 -6.35,0; 13 -8.89,0; 14 -11.43,0; 15 -13.97,0; 16 -16.51,0; 17 -19.05,0; 18 -21.59,0
TSW-114-XX-G-S = drill 1 pad 1.5 octagon: 1 16.51,0; 2 13.97,0; 3 11.43,0; 4 8.89,0; 5 6.35,0; 6 3.81,0; 7 1.27,0; 8 -1.27,0; 9 -3.81,0; 10 -6.35,0; 11 -8.89,0; 12 -11.43,0; 13 -13.97,0; 14 -16.51,0
JP1 = drill 0.914 long: 1 0,-1.27; 2 0,1.27
C450H305 = drill 3.05 pad 4.5: 1 0,0
C140H90 = drill 0.9 pad 1.4: 1 0,0
C195H135 = drill 1.35 pad 1.95: 1 0,0
SOT-23 = smd 0.787 x 0.889: 1 0.025,-1.016; 2 -0.94,1.016; 3 0.991,1.016
R0402 = smd 0.6 x 0.7: 1 -0.5,0; 2 0.5,0
QFN50P500X500X80-29T335 = smd 1.01 x 0.27: 1 -2.36,1.5; 2 -2.36,1; 3 -2.36,0.5; 4 -2.36,0; 5 -2.36,-0.5; 6 -2.36,-1; 7 -2.36,-1.5; 15 2.36,-1.5; 16 2.36,-1; 17 2.36,-0.5; 18 2.36,0; 19 2.36,0.5; 20 2.36,1; 21 2.36,1.5 | smd 0.27 x 1.01: 8 -1.5,-2.36; 9 -1,-2.36; 10 -0.5,-2.36; 11 0,-2.36; 12 0.5,-2.36; 13 1,-2.36; 14 1.5,-2.36; 22 1.5,2.36; 23 1,2.36; 24 0.5,2.36; 25 0,2.36; 26 -0.5,2.36; 27 -1,2.36; 28 -1.5,2.36 | smd 3.35 x 3.35: 29 0,0
SSW-103-02-G-D = drill 1 pad 1.5 octagon: 1 -2.54,-1.27; 2 -2.54,1.27; 3 0,-1.27; 4 0,1.27; 5 2.54,-1.27; 6 2.54,1.27
SSW-105-02-G-D = drill 1 pad 1.5 octagon: 1 -5.08,-1.27; 2 -5.08,1.27; 3 -2.54,-1.27; 4 -2.54,1.27; 5 0,-1.27; 6 0,1.27; 7 2.54,-1.27; 8 2.54,1.27; 9 5.08,-1.27; 10 5.08,1.27

### Placement (x,y rotation side)
C101  0.1uF  [C0201]  82.75,12.9 0 top
C102  4.7uF  [C0201]  82.55,10.29 180 top
C103  4.7uF  [C0201]  80.04,49.53 180 top
C104  1uF  [C0201]  83.72,12.24 0 top
C105  1uF  [C0201]  80.04,48.06 180 top
C106  0.1uF  [C0201]  80.04,48.79 180 top
C107  4.7uF  [C0201]  84.84,47.37 270 top
C108  0.1uF  [C0201]  84.96,13.97 0 top
C109  0.1uF  [C0201]  79.04,47.73 180 top
C120  4.7uF  [C0201]  82.55,9.53 180 top
D101  BAT60JFILM  [SOD2512X117]  83.99,8.51 90 top
D103  BAT60JFILM  [SOD2512X117]  86.82,43.05 180 top
DRILEGEND  [DRILEGEND]  -69.78,-61.67 0 top  (outside the outline)
J101  uUSB-B  [USB_473461001]  89.92,11.56 90 top
J102  uUSB-B  [USB_473461001]  89.92,48.9 90 top
J103  02X20  [HDRV20W64P254_2X10_3276X876X838B]  31.11,60.2 270 top
J301  TSW-118-07-G-S  [TSW-118-XX-G-S]  3.81,39.5 90 top
J302  TSW-114-07-G-S  [TSW-114-XX-G-S]  24.13,34.42 90 top
JP101  [JP1]  84.34,23.22 270 top
JP102  [JP1]  84.11,36.98 270 top
MTH1  43.18,68.71 0 top
MTH2  76.2,68.71 0 top
MTH3  43.18,2.67 0 top
MTH4  76.2,2.67 0 top
PP201  POGOS13-503  [C140H90]  52.83,10.67 0 top
PP202  POGOS13-503  [C140H90]  52.83,9.14 0 top
PP203  POGOS13-503  [C140H90]  52.83,12.19 0 top
PP204  POGOS13-503  [C140H90]  52.58,7.62 0 top
PP205  POGOS13-503  [C140H90]  62.48,14.99 0 top
PP206  POGOS13-503  [C140H90]  54.61,15.24 0 top
PP207  POGOS13-503  [C140H90]  55.88,13.97 0 top
PP208  POGOS13-503  [C140H90]  59.94,15.49 0 top
PP301  POGOS19-501  [C195H135]  49.53,61.09 0 top
PP302  POGOS19-501  [C195H135]  49.53,58.55 0 top
PP303  POGOS19-501  [C195H135]  49.53,56.01 0 top
PP304  POGOS19-501  [C195H135]  49.53,53.47 0 top
PP305  POGOS19-501  [C195H135]  49.53,50.93 0 top
PP306  POGOS19-501  [C195H135]  49.53,48.39 0 top
PP307  POGOS19-501  [C195H135]  49.53,45.85 0 top
PP308  POGOS19-501  [C195H135]  49.53,43.31 0 top
PP309  POGOS19-501  [C195H135]  49.53,40.77 0 top
PP310  POGOS19-501  [C195H135]  49.53,38.23 0 top
PP311  POGOS19-501  [C195H135]  49.53,35.69 0 top
PP312  POGOS19-501  [C195H135]  49.53,33.15 0 top
PP313  POGOS19-501  [C195H135]  49.53,30.61 0 top
PP314  POGOS19-501  [C195H135]  49.53,28.07 0 top
PP315  POGOS19-501  [C195H135]  49.53,25.53 0 top
PP316  POGOS19-501  [C195H135]  49.53,22.99 0 top
PP317  POGOS19-501  [C195H135]  49.53,20.45 0 top
PP318  POGOS19-501  [C195H135]  49.53,17.91 0 top
PP319  POGOS19-501  [C195H135]  69.85,50.93 0 top
PP320  POGOS19-501  [C195H135]  69.85,48.39 0 top
PP321  POGOS19-501  [C195H135]  69.85,45.85 0 top
PP322  POGOS19-501  [C195H135]  69.85,43.31 0 top
PP323  POGOS19-501  [C195H135]  69.85,40.77 0 top
PP324  POGOS19-501  [C195H135]  69.85,38.23 0 top
PP325  POGOS19-501  [C195H135]  69.85,35.69 0 top
PP326  POGOS19-501  [C195H135]  69.85,33.15 0 top
PP327  POGOS19-501  [C195H135]  69.85,30.61 0 top
PP328  POGOS19-501  [C195H135]  69.85,28.07 0 top
PP329  POGOS19-501  [C195H135]  69.85,25.53 0 top
PP330  POGOS19-501  [C195H135]  69.85,22.99 0 top
PP331  POGOS19-501  [C195H135]  69.85,20.45 0 top
PP332  POGOS19-501  [C195H135]  69.85,17.91 0 top
PP401  POGOS13-503  [C140H90]  54.86,36.32 0 top
PP402  POGOS13-503  [C140H90]  55.88,37.59 0 top
Q101  MMSS8050-H-TP  [SOT-23]  62.62,18.15 0 top
Q102  MMSS8050-H-TP  [SOT-23]  59.82,12.52 0 top
R101  10k  [R0402]  55.75,12.32 180 top
R102  10k  [R0402]  55.75,11.18 0 top
R103  10k  [R0402]  55.75,6.73 180 top
R104  10k  [R0402]  55.75,9.91 0 top
R105  10k  [R0402]  60.2,18.67 270 top
R106  10k  [R0402]  54.99,33.91 90 top
R107  10k  [R0402]  58.67,37.72 180 top
R109  10k  [R0402]  55.75,8.64 180 top
R110  10k  [R0402]  65.15,18.67 90 top
R112  10k  [R0402]  56.52,17.14 180 top
R113  00  [R0402]  78.1,38.23 0 top
R114  10k  [R0402]  83.57,26.04 180 top
R115  10k  [R0402]  85.47,18.8 90 top
R116  10k  [R0402]  83.82,20.7 90 top
R117  22.1K  [R0402]  86.61,16.74 90 top
R118  47.5K  [R0402]  86.61,18.8 90 top
R119  10k  [R0402]  83.31,34.42 180 top
R120  10k  [R0402]  76.96,49.02 90 top
R121  10k  [R0402]  77.09,42.16 270 top
R122  22.1K  [R0402]  78.09,49.01 90 top
R123  47.5K  [R0402]  78.1,51.1 90 top
R124  00  [R0402]  78.1,35.69 0 top
R125  00  [R0402]  56.52,15.75 0 top
U101  CP2102N-A01-GQFN28R  [QFN50P500X500X80-29T335]  81.48,16.36 90 top
U102  CP2102N-A01-GQFN28R  [QFN50P500X500X80-29T335]  81.35,44.49 270 top
X101  75869-131LF  [SSW-103-02-G-D]  32.38,4.57 90 top
X102  75869-101LF  [SSW-105-02-G-D]  32.38,21.08 90 top

### Tracks (layer width: path | path; a pad name or v marks a point on that pad's centre or on a via)
+3V3  (via drill 0.3)
  Top 0.216: R107.1 v60.07,37.72 | R106.1 v54.99,32.26
  Top 0.254: R101.1 v57.15,12.32 | R109.1 v57.15,8.64 | R103.1 v57.15,6.73
  pour Route15 (rank 6): 0.15,73.66 0.15,0 72.39,0 72.39,73.66
+5V  (via drill 0.3)
  Top 0.216: v88.01,42.04 88,42.05 D103.1 88,44.06 v88.01,44.07
  Top 0.305: D101.1 83.99,5.82 v84.02,5.79 | D101.1 82.61,7.33 v82.6,7.34 | D101.1 85.31,7.33 v85.32,7.32 | D103.1 88.02,43.03 v89.48,43.03
  Route15 0.813: PP321.1 74.6,45.85 74.65,45.8
  pour Route15 (rank 4): 20.5,73.66 91.44,73.66 91.44,0 73.66,0 73.94,64.54 26.14,64.77 26.29,64.62 26.19,64.52 26.19,45.44 25.17,44.42 23.6,44.42 20.5,47.52
D1:3V3_USB0  (via drill 0.3)
  Top 0.216: R121.2 v77.09,40.89 | U102.6 80.35,47.97 80.31,48.01 80.31,48.03 C105.1 C106.1 C103.1 | C103.1 v80.9,49.53 | C103.1 80.28,50.27 v80.26,50.29 | R119.1 v84.58,34.42
  Route15 0.216: v84.58,34.42 82.94,36.06 82.46,36.06 81.92,36.59 81.92,37.08 78.1,40.89 v77.09,40.89 80.52,44.33 80.52,45.93 80.52,45.94 80.52,47.8 80.31,48.01 80.31,48.46 80.52,48.66 80.52,49.53 | v80.26,50.29 80.52,50.04 80.52,49.53 | v80.9,49.53 80.52,49.53
  pour Route15: 83.82,33.02 86.36,33.02 86.36,40.64 85.09,40.64 85.09,50.8 78.74,50.8 78.74,44.45 77.47,43.18 76.2,41.91 76.2,40.64 78.74,38.1
D1:3V3_USB1  (via drill 0.3)
  Top 0.203: 82.62,12.78 C101.1 82.62,12.78 | 82.62,12.78 82.62,12.62 | 82.62,12.62 83,12.24 C104.1 | 82.62,12.78 82.62,12.62 | 82.62,12.62 82.64,12.6 v82.64,12.39 | C102.1 v83.31,10.29
  Top 0.216: R116.2 v83.06,21.21 | v84.96,26.04 R114.1
  Top 0.406: U101.6 82.48,12.92 C101.1
  Route15 0.216: 82.64,20.79 v83.06,21.21 84.07,22.23 84.07,22.99 84.45,23.37 84.45,25.53 v84.96,26.04 | v82.64,12.39 82.71,12.32 83.31,12.32 83.82,11.81 83.82,10.79 v83.31,10.29
  pour Route15 (rank 2): 77.47,26.67 77.47,8.89 87.63,8.89 87.63,26.67
D1:+VBUS_UART  (via drill 0.3)
  Top 0.216: C108.1 83.01,13.97 U101.7 | C108.1 84.83,14.09 84.83,14.25 85.31,14.74 85.33,14.74 86.61,16.02 R117.1 | C108.1 v84.71,13.34 | 85.47,10.26 v85.47,9.4 | D101.2 84.07,9.61 v84.07,8.64
  Top 0.406: J101.1 85.47,10.26 84.56,10.26 D101.2 83.57,9.69 83.56,9.68 83.06,9.68 83.05,9.69 82.96,9.69 C120.1
  pour Route15: 84.2,13.84 84.2,9.53 84.07,9.4 83.31,9.4 83.31,7.87 86.61,7.87 86.74,8 86.74,16.38 85.6,16.38 84.2,14.99
D1:+VBUS_UART0  (via drill 0.3)
  Top 0.152: v85.72,46.48 85.72,44.83 v85.6,44.7
  Top 0.216: 79.3,47.04 C109.1 | v79.25,46.99 79.39,46.85 U102.7
  Top 0.254: 79.3,47.04 v79.25,46.99 78.74,46.99 | 78.74,46.99 v78.49,46.99 | R122.1 77.72,48.15 v77.72,46.99 78.74,46.99
  Bottom 0.216: v77.72,46.99 78.24,46.48 78.8,46.48 79.1,46.78 79.1,46.84 v79.25,46.99 83.6,46.99 83.99,46.6 84.41,46.6 84.8,46.99 85.22,46.99 v85.72,46.48
  pour Top: 84.68,47.68 84.68,46.48 84.66,46.46 85.29,46.46 85.32,46.48 85.32,42.8 85.34,42.77 86.11,42.77 86.13,42.8 86.13,47.35 86.21,47.42 86.69,47.42 86.69,47.68 86.59,47.68
  pour Bottom: 77.72,47.5 77.72,46.74 78.23,46.74 78.23,45.97 85.34,45.97 85.34,43.69 86.11,43.69 86.11,47.5
D1:D_N
  Top 0.216: J101.2 86.18,10.91 86.03,11.05 82.54,11.05 82.32,11.28 82.32,11.51 81.98,11.84 U101.5
D1:D_P  (via drill 0.3)
  Top 0.216: J101.3 83,11.56 v82.91,11.65 | v81.48,11.51 U101.4
  Bottom 0.216: v82.91,11.65 82.76,11.51 v81.48,11.51
D1:DTR  (via drill 0.3)
  Top 0.254: Q102.2 v57.99,13.54 | v57.99,13.54 | v65.2,13.54 65.2,18.12 R110.1 | U101.28 78.86,14.86 v77.72,13.72
  Bottom 0.254: v57.99,13.54 v65.2,13.54 65.38,13.72 v77.72,13.72
D1:N$1
  Top 0.254: Q101.3 R110.2
D1:N$2
  Top 0.254: Q102.3 60.81,14.98 60.92,15.09 60.92,17.44 R105.2
D1:N$3
  Top 0.216: U101.12 84.42,16.86 84.61,17.05 84.61,18.02 84.58,18.05 84.58,19.44 R116.1
D1:N$4
  Top 0.216: R118.1 R117.2 86.33,16.95 86.16,16.95 85.48,16.27 85.48,15.41 85.18,15.11 84.84,15.11 84.73,15 84.42,15 84.27,14.86 U101.8
D1:N$5  (via drill 0.3)
  Top 0.254: U101.25 76.99,16.36 76.96,16.38 76.33,15.75 v76.33,15.11 | v57.91,15.75 R125.2
  Bottom 0.254: v76.33,15.11 68.96,15.11 67.56,16.51 59.18,16.51 58.42,15.75 v57.91,15.75
D1:N$6
  Top 0.216: U101.11 83.87,16.38 84.84,16.38 85.47,17.02 R115.1
D1:N$8  (via drill 0.3)
  Top 0.216: U102.11 78.15,44.49 77.22,43.56 v76.71,43.56 | R120.1 76.71,48.27 v76.71,47.75
  Bottom 0.216: v76.71,43.56 76.71,44.34 76.59,44.47 76.59,45.2 76.71,45.32 v76.71,47.75
D1:N$9
  Top 0.216: R121.1 77.38,42.37 U102.12
D1:N$10  (via drill 0.3)
  Top 0.216: R122.2 78.1,49.53 R123.1 78.43,50.6 v78.87,50.16 | U102.8 78.76,46.23 v77.72,46.23
  Bottom 0.216: v77.72,46.23 77.34,46.23 77.21,46.36 77.21,47.2 77.34,47.34 77.34,49.15 78.36,50.16 v78.87,50.16
D1:RTS  (via drill 0.3)
  Top 0.254: R105.1 Q101.2 61.72,19.22 v61.72,20.32 | v77.34,17.02 77.5,16.86 U101.24
  Bottom 0.254: v61.72,20.32 66.93,20.32 68.07,19.18 75.95,19.18 77.34,17.78 v77.34,17.02
D1:UART0_RESET_L  (via drill 0.3)
  Top 0.216: R119.2 82.81,36.95 JP102.1 | U102.9 v77.47,45.49
  Bottom 0.216: v77.47,45.49 77.32,45.34 77.26,45.34 76.96,45.04 76.96,44.62 77.22,44.35 77.22,43.43 82.84,37.82 JP102.1
D1:UART_RESET_L  (via drill 0.3)
  Top 0.216: U101.9 83.85,15.37 84.58,15.37 84.84,15.62 v84.96,15.62 | R114.2 JP101.1
  Bottom 0.216: JP101.1 83.07,23.1 84.96,21.21 84.96,19.85 v84.96,15.62
D1:UART_RX0
  Top 0.216: R124.2 82.54,39.62 83.44,39.62 84.71,40.89 84.71,44.23 84.45,44.49 U102.25
D1:UART_TX0  (via drill 0.3)
  Top 0.203: 76.34,44.43 75.31,43.4 75.31,41.02 76.3,40.03
  Top 0.216: U102.26 84.68,44.99 v84.71,44.96 | 76.3,40.03 77.5,38.84 78.01,38.84 78.16,38.69 78.16,38.67 R113.2 | v77.47,44.83 76.74,44.83 76.34,44.43
  Bottom 0.216: v84.71,44.96 81.61,44.96 81.57,45.01 81.14,45.01 80.97,44.83 v77.47,44.83
D1:USB0_D_N  (via drill 0.3)
  Top 0.216: J102.2 85.57,48.24 85.57,48.37 82.3,48.37 v82.3,48.25 | v80.9,48.28 80.9,46.9 U102.5
  Bottom 0.216: v82.3,48.25 80.94,48.25 v80.9,48.28
D1:USB0_D_P
  Top 0.216: J102.3 85.57,48.9 85.57,48.81 82.57,48.81 82.54,48.84 82.05,48.84 81.7,48.49 81.7,48.17 81.35,47.82 U102.4
D1:USB1_UART_TX_X  (via drill 0.3)
  Top 0.254: R112.1 v57.78,17.14 | v77.6,15.75 78.56,15.75 78.58,15.77 79.04,15.77 U101.26
  Bottom 0.254: v57.78,17.14 68.2,17.14 69.6,15.75 v77.6,15.75
ESP32_UART5  (via drill 0.3)
  Top 0.254: R112.2 54.61,15.74 PP206.1 | v38.61,15.39 33.66,10.44 X101.5
  Bottom 0.254: PP206.1 38.76,15.24 v38.61,15.39
ESP_EN  (via drill 0.3)
  Top 0.254: Q101.1 62.64,15.14 PP205.1 62.51,14.96 v62.51,5.79
  Bottom 0.152: 36.17,2.03 39.62,2.03 40.7,3.11 40.7,3.69 42.15,5.15 44.21,5.15 45.29,4.06 60.78,4.06 v62.51,5.79
  Bottom 0.254: X101.1 36.17,2.03
ESP_IO0  (via drill 0.3)
  Top 0.203: v59.82,7.75 59.94,7.87 59.94,11.6
  Top 0.254: PP208.1 59.94,11.6 Q102.1
  Bottom 0.203: X101.6 32.51,8.51 36.07,8.51 36.96,7.62 47.37,7.62 47.78,7.21 49.3,7.21 50.29,6.22 55.37,6.22 56.9,7.75 v59.82,7.75
GND  (via drill 0.3)
  Top 0.203: C101.2 83.39,12.9 v83.57,13.08 | C104.2 84.4,12.24 v84.45,12.19 | C102.2 v81.66,10.29 | C120.2 v81.66,9.53
  Top 0.216: C108.2 v85.72,13.97 | R115.2 v85.47,20.07 | R118.2 v86.61,20.07 | U102.29 81.85,44.99 U102.3 81.85,47.49 v81.96,47.59 | U102.29 80.14,43.27 v80.14,43.18 | U102.29 80.12,45.72 v80.01,45.72 | U102.29 82.66,43.18 v82.68,43.18 | R120.2 v76.96,50.55 | C103.2 v79.25,49.53 | C106.2 79.76,48.77 v79.25,48.77 | C105.2 79.53,48.31 v79.25,48.31 | C109.2 78.77,47.75 v78.33,47.75 | R123.2 v78.1,52.32 | C107.2 v84.2,47.12
  Top 0.254: R102.2 v57.15,11.18 | R104.2 v57.15,9.91 | U101.3 80.98,13.42 v80.52,12.95
  Top 0.305: J102.5 v85.62,50.2 v85.62,50.19 | J101.5 87.21,12.83 v86.11,12.83
  other vias: 81.48,16.36 81.35,44.49 80.26,17.53 80.26,15.24 82.8,15.24
  pour Route2: 0,73.66 0,0 91.44,0 91.44,73.66
HEADERS1:A0
  Bottom 0.152: J301.5 19.02,50.93 21.21,53.11 26.11,53.11 30.27,48.96 34.1,48.96 34.32,49.17 47.78,49.17 PP305.1
HEADERS1:A1
  Bottom 0.152: PP306.1 47.35,46.2 27.51,46.2 25.11,48.6 25.11,48.79 24.32,49.58 5,49.58 J301.6
HEADERS1:A2
  Bottom 0.152: J301.7 22.15,45.85 23.24,46.94 24.92,46.94 27.98,43.88 47.56,43.88 PP307.1
HEADERS1:A3
  Bottom 0.152: J301.8 5.05,42.06 25.02,42.06 25.76,41.33 44.92,41.33 45.84,42.24 48.46,42.24 PP308.1
HEADERS1:A4
  Bottom 0.152: J301.9 20.24,40.77 21.41,39.6 28.19,39.6
  Bottom 0.203: 35.15,40.74 35.05,40.84 35.05,40.89 | 28.19,39.6 29.58,40.98 34.91,40.98 35.15,40.74 | PP309.1 46.1,40.77 45.21,39.88 36.02,39.88 35.15,40.74
HEADERS1:A5
  Bottom 0.152: PP310.1 35.84,38.23 34.74,37.12 34.74,36.89 33.86,36.02 26.16,36.02 24.93,37.25 23.72,37.25 22.75,38.23 J301.10
HEADERS1:COM1_RX
  Bottom 0.152: 20.24,26.9 19.94,26.9 | 20.24,26.9 4.98,26.9 J301.14 | 20.24,26.9 24.92,26.9 26.83,28.82 | 43.82,28.78 44.54,28.07 PP314.1
  Bottom 0.203: 43.82,28.78 26.87,28.78 26.83,28.82
HEADERS1:COM1_TX
  Bottom 0.152: J301.15 13.13,25.53 14.53,24.13 25.04,24.13 26.96,26.05 | 45.16,24.99 49,24.99 PP315.1 | 45.16,24.99 44.83,24.99 | 44.83,24.99 42.39,27.43 | 44.83,24.99 45.16,24.99
  Bottom 0.203: 42.39,27.43 28.35,27.43 26.96,26.05
HEADERS1:D02
  Bottom 0.152: 24.31,21.82 4.98,21.82 J301.16
  Bottom 0.203: PP316.1 45.09,22.99 45.02,23.05 37.78,23.05 36.21,24.63 29.97,24.63 27.16,21.82 24.31,21.82
HEADERS1:D03_CAN1_RX
  Bottom 0.152: PP317.1 49.38,20.6 45.87,20.6 | 19.05,18.78 5.48,18.78 J301.17
  Bottom 0.203: 19.05,18.78 19.52,19.25 24.83,19.25 26.19,20.6 30.18,20.6 30.7,20.08 34.07,20.08 34.59,20.6 45.87,20.6
HEADERS1:D04_CAN1_TX
  Bottom 0.152: J301.18 21.03,17.91 23.56,15.38 24.95,15.38 26.95,17.37 | 46.63,17.75 46.58,17.8 49.43,17.8 PP318.1
  Bottom 0.203: 26.95,17.37 27.33,17.75 30.48,17.75 30.7,17.54 34.07,17.54 34.29,17.75 46.63,17.75
HEADERS1:D5  (via drill 0.3)
  Top 0.152: PP332.1 v69.85,8.26 | v24,3.17 24,17.78 J302.14
  Bottom 0.152: v69.85,8.26 68.2,6.6 61.98,6.6 60.07,4.7 45.72,4.7 44.7,5.71 41.53,5.71 38.99,3.17 v24,3.17
HEADERS1:D6  (via drill 0.3)
  Top 0.203: J302.13 25.65,18.92 25.78,18.92 v25.78,5.33 | v70.48,9.65 70.48,16.8 71.08,17.4 71.08,19.22 PP331.1
  Bottom 0.203: 35.18,5.71 34.8,5.33 34.31,5.33 34.07,5.58 30.7,5.58 30.46,5.33 v25.78,5.33 | 35.18,5.71 35.31,5.84 | 35.18,5.71 36.32,6.86 49.15,6.86 50.55,5.46 59.18,5.46 61.21,7.49 68.33,7.49 v70.48,9.65
HEADERS1:D9
  Bottom 0.203: J302.10 25.4,28.07 27.19,29.86 43.8,29.86 44.58,29.08 48.81,29.08 49.02,29.3 68.62,29.3 PP328.1
HEADERS1:D10
  Bottom 0.203: J302.9 26.26,30.61 28.14,32.49 43.51,32.49 43.54,32.51 48.43,32.51 49.02,31.92 52.64,31.92 54.13,30.43 69.67,30.43 PP327.1
HEADERS1:D11
  Bottom 0.203: PP326.1 53.34,33.15 52.07,34.42 34.04,34.42 33.53,33.91 24.89,33.91 J302.8
HEADERS1:D14  (via drill 0.35)
  Top 0.152: PP323.1 65.53,45.09 v65.53,64.77 | v21.08,68.58 21.08,43.81 J302.5
  Bottom 0.152: v65.53,64.77 39.62,64.77 35.81,68.58 v21.08,68.58
HEADERS1:D15  (via drill 0.3)
  Top 0.152: PP322.1 66.27,46.89 v66.27,66.4 | v21.74,69.47 21.74,45.7 J302.4
  Bottom 0.152: v66.27,66.4 48.16,66.4 46.91,65.15 40.82,65.15 36.5,69.47 v21.74,69.47
HEADERS1:EN_3V3  (via drill 0.3)
  Top 0.152: PP320.1 68.22,50.01 68.22,68.56 v68.25,68.58 | v23.72,71.53 23.72,51.91 23.15,51.33 23.15,49.37 J302.2
  Bottom 0.152: v68.25,68.58 47.29,68.58 44.37,71.5 24.76,71.5 24.74,71.48 23.77,71.48 v23.72,71.53
HEADERS1:I2C_SCK
  Bottom 0.203: PP329.1 55.12,25.53 53.89,26.76 49.02,26.76 48.81,26.54 45.59,26.54 44.31,27.83 26.43,27.83 J302.11
HEADERS1:I2C_SDA
  Bottom 0.203: PP330.1 55.63,22.99 54.31,24.3 49.02,24.3 48.93,24.38 44.2,24.38 43.43,25.15 26.8,25.15 24.64,22.99 J302.12
HEADERS1:SPI_CLK
  Bottom 0.152: J301.11 20.95,35.69 22.16,34.48 33.06,34.48 34.27,35.69 PP311.1
HEADERS1:SPI_MISO
  Bottom 0.152: J301.13 12.73,30.61 13.74,29.59 25.98,29.59 26.63,30.24 | PP313.1 48.51,29.59 44.54,29.59 43.72,30.41
  Bottom 0.203: 26.63,30.24 26.8,30.41 43.72,30.41
HEADERS1:SPI_MOSI
  Bottom 0.152: J301.12 4.95,32 26.9,32 28.12,33.22 40.84,33.22 40.92,33.15 PP312.1
HEADERS1:VBAT  (via drill 0.3)
  Top 0.152: PP319.1 69.85,69.27 v69.55,69.57 | v24.54,71.96 24.54,51.33 J302.1
  Bottom 0.152: v69.55,69.57 47.45,69.57 44.93,72.08 24.66,72.08 v24.54,71.96
HEADERS1:VREF+
  Bottom 0.152: J301.3 30.47,56.01 30.67,56.2 34.1,56.2 34.3,56.01 PP303.1
MTCK_E  (via drill 0.3)
  Top 0.203: X102.4 31.11,17.91 32.45,16.57 32.45,10.35 v32.38,10.29
  Top 0.254: R102.1 53.34,11.18 PP201.1
  Bottom 0.203: v32.38,10.29 32.77,10.67 39.37,10.67
  Bottom 0.254: PP201.1 39.37,10.67 39.14,10.67
MTDI_E  (via drill 0.3)
  Top 0.254: v39.9,9.91 39.9,22.2 v39.85,22.25 | R104.1 | R104.1 53.59,9.91 PP202.1 | R109.2 55.25,9.9 R104.1
  Bottom 0.254: PP202.1 52.07,9.91 v39.9,9.91 39.85,9.91 | v39.85,22.25 39.75,22.35 32.38,22.35 X102.8
MTDO_E  (via drill 0.3)
  Top 0.203: X102.6 29.34,19.3 v29.34,12.32
  Top 0.254: R101.2 52.96,12.32 PP203.1
  Bottom 0.203: v29.34,12.32 39.88,12.32 40,12.19
  Bottom 0.254: 40,12.19 PP203.1
MTMS_E  (via drill 0.3)
  Top 0.203: X102.2 v31.11,9.4
  Top 0.254: R103.2 54.36,7.62 PP204.1
  Bottom 0.203: 51.94,8.26 51.05,9.14 31.37,9.14 v31.11,9.4
  Bottom 0.254: PP204.1 51.94,8.26
N$1  (via drill 0.3)
  Top 0.254: R107.2 56.01,37.72 PP402.1 55.88,52.27 v55.93,52.32
  Bottom 0.254: v55.93,52.32 50.16,52.32 50.05,52.21 34.89,52.21 34.12,51.45 32.25,51.45 J103.7
N$2  (via drill 0.3)
  Top 0.254: R106.2 54.99,36.2 PP401.1 | v35.94,37.29 35.94,48.23 35.36,48.82 32.33,48.82 J103.9
  Bottom 0.254: PP401.1 51.21,36.32 50.59,36.94 49.01,36.94 48.98,36.91 36.32,36.91 v35.94,37.29
N$3  (via drill 0.3)
  Top 0.203: J302.7 26.29,37.85 v26.29,62.48 | v72.52,62.48 72.52,38.35 PP325.1 R124.1
  Bottom 0.203: v26.29,62.48 v72.52,62.48
N$4  (via drill 0.3)
  Top 0.203: v76.83,38.23 R113.1
  Bottom 0.203: v76.83,38.23 PP324.1 66.67,38.23 65.15,39.75 53.59,39.75 | 53.59,39.75 53.47,39.75 | 53.59,39.75 50.25,39.75 50.04,39.54 49.02,39.54 48.81,39.75 45.97,39.75 45.21,38.99 34.42,38.99 33.87,38.45 30.66,38.45 30.44,38.23 J302.6
STM32_RESET_L  (via drill 0.3)
  Top 0.254: J103.15 29.21,44.32 v29.21,61.75
  Bottom 0.152: J301.1 28.55,61.09 v29.21,61.75
  Bottom 0.203: PP301.1 44.07,61.09 43.56,61.59 29.36,61.59 v29.21,61.75
UART5_ESP32  (via drill 0.3)
  Top 0.254: R125.1 56.02,14.11 PP207.1 55.08,13.17 52.43,13.17 49.33,10.07 v49.33,5.36
  Bottom 0.152: v49.33,5.36 48.79,5.89 48.63,5.89 48.33,6.2 41,6.2 39.37,4.57 X101.3

### Text on the board
Top: MeadowF7TestBoard REVA
tPlace: STM32 | STM32 | MeadowF7TestBoard | REV
bPlace: F7 Meadow / Debug Rev B
bNames: SWDIO | SWCLK | ESP_TX | ESP_RX | MTDO | MTCK | MTDI | MTMS
Document: MeadowF7TestBoard | REV. A | ENGINEER:
tDocu: uMeadow | Rev:
DrillLegend: LAYER-STACK
DrillLegend_01-16: 01-16